# EasyEDA Pro project srm_不晦启明_B.eprj, board PCB1
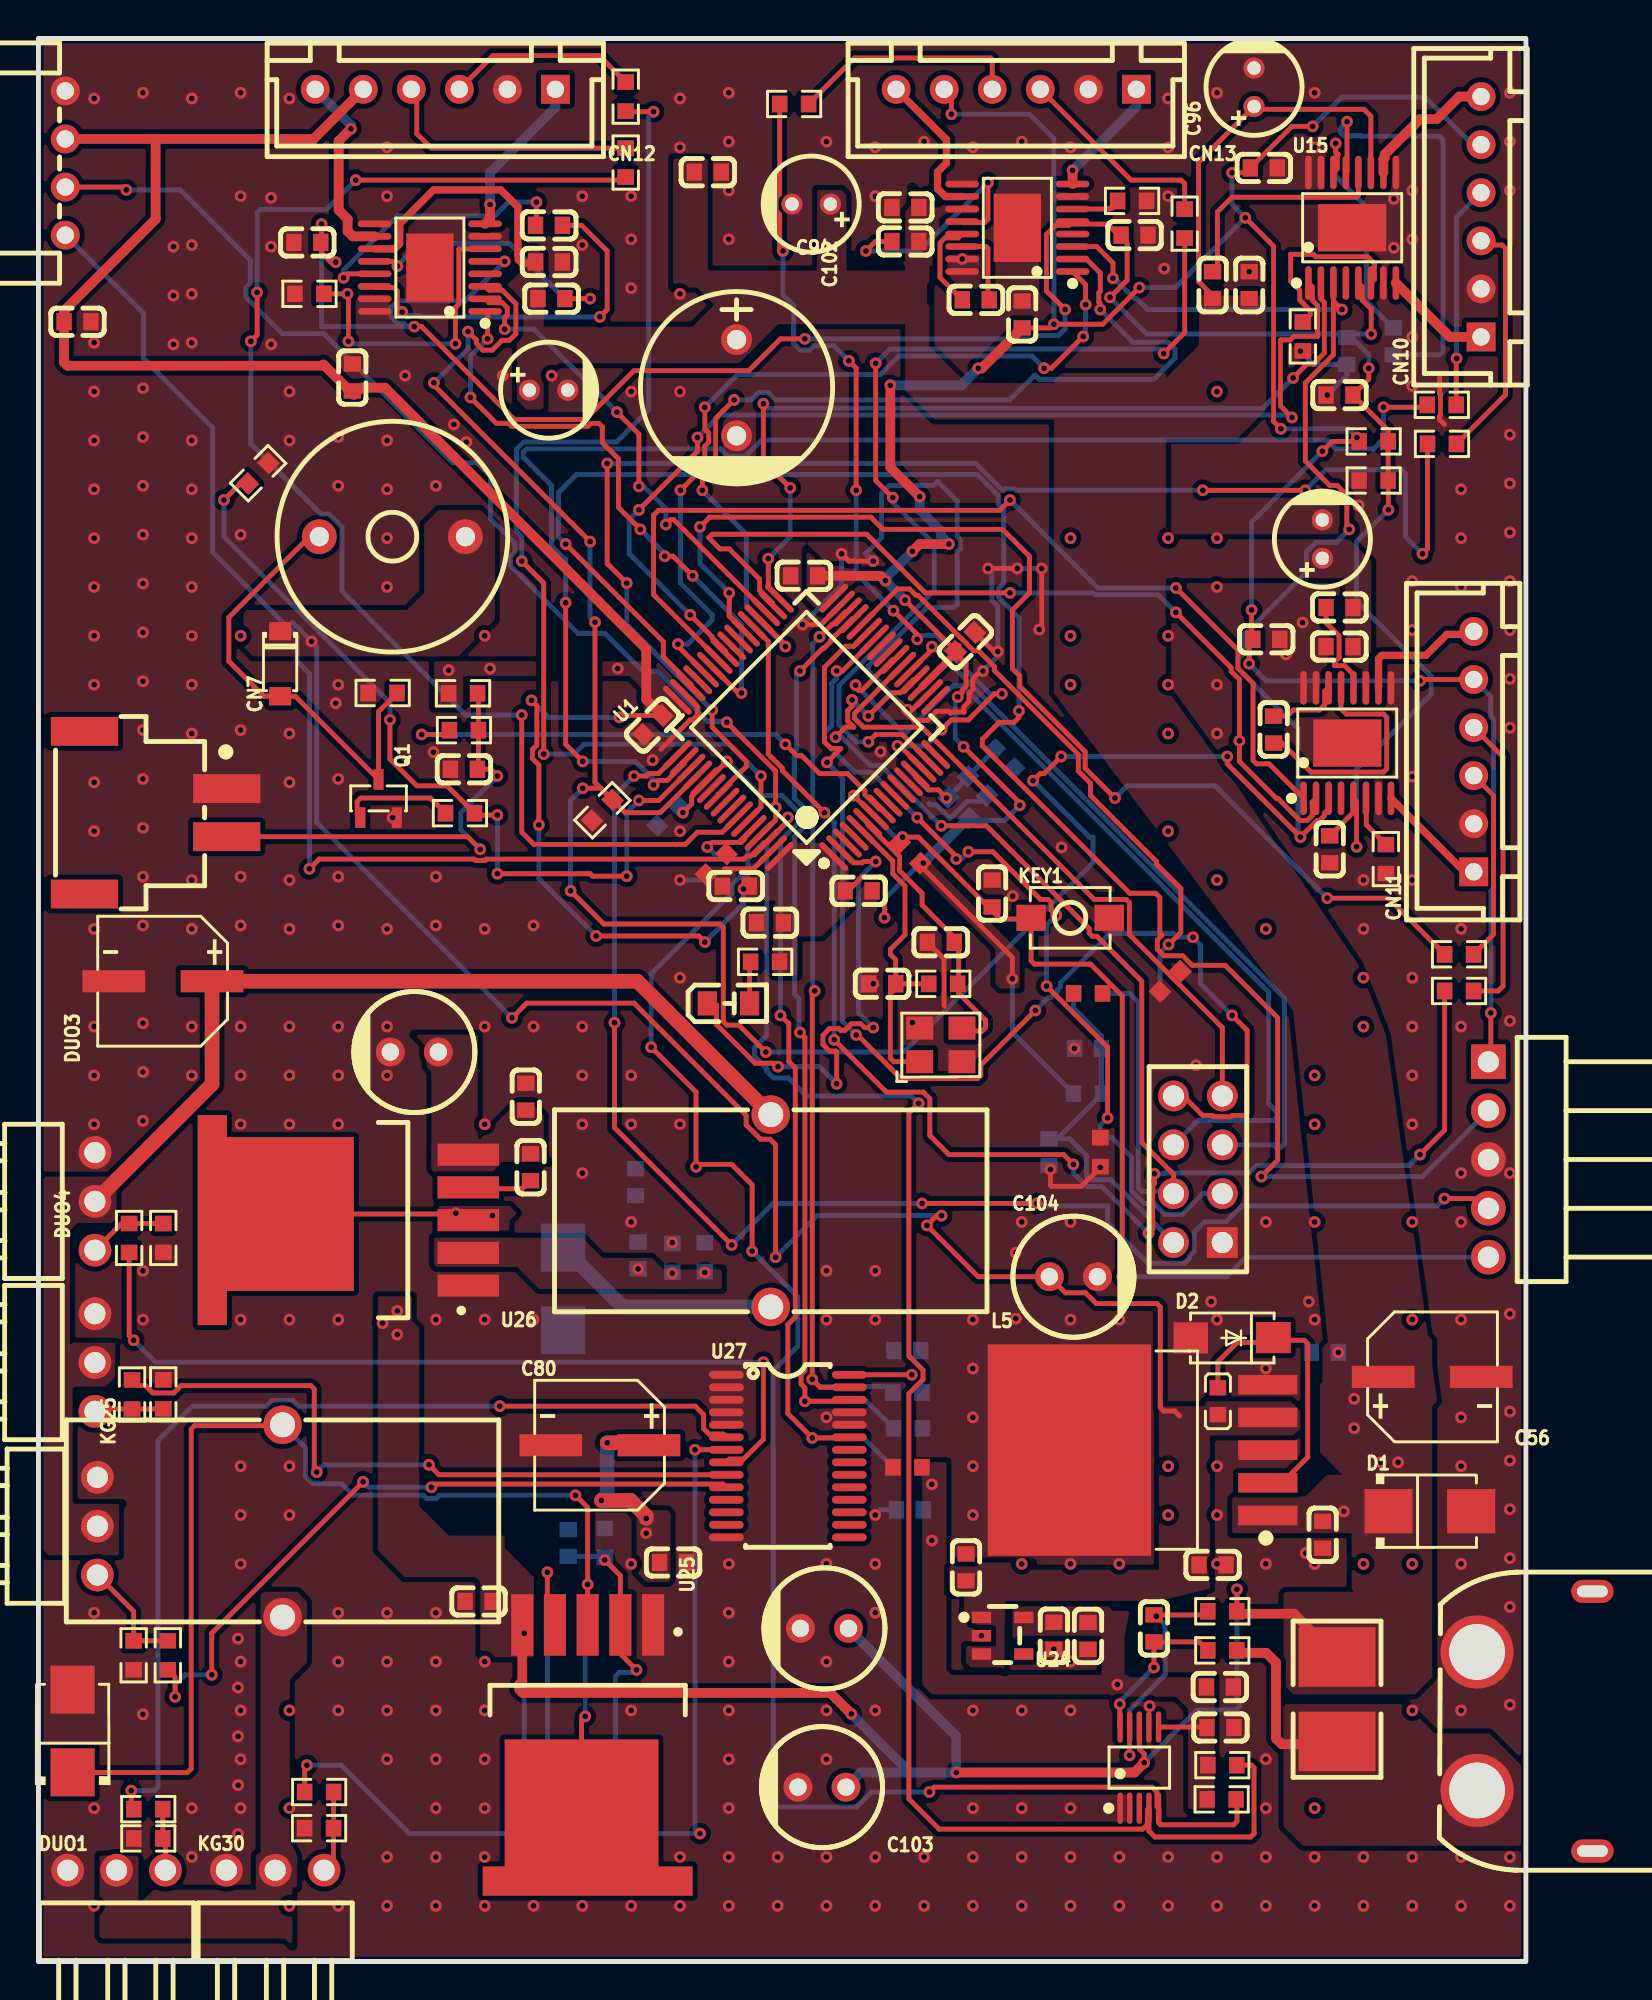
[diagram p13: board, top side]
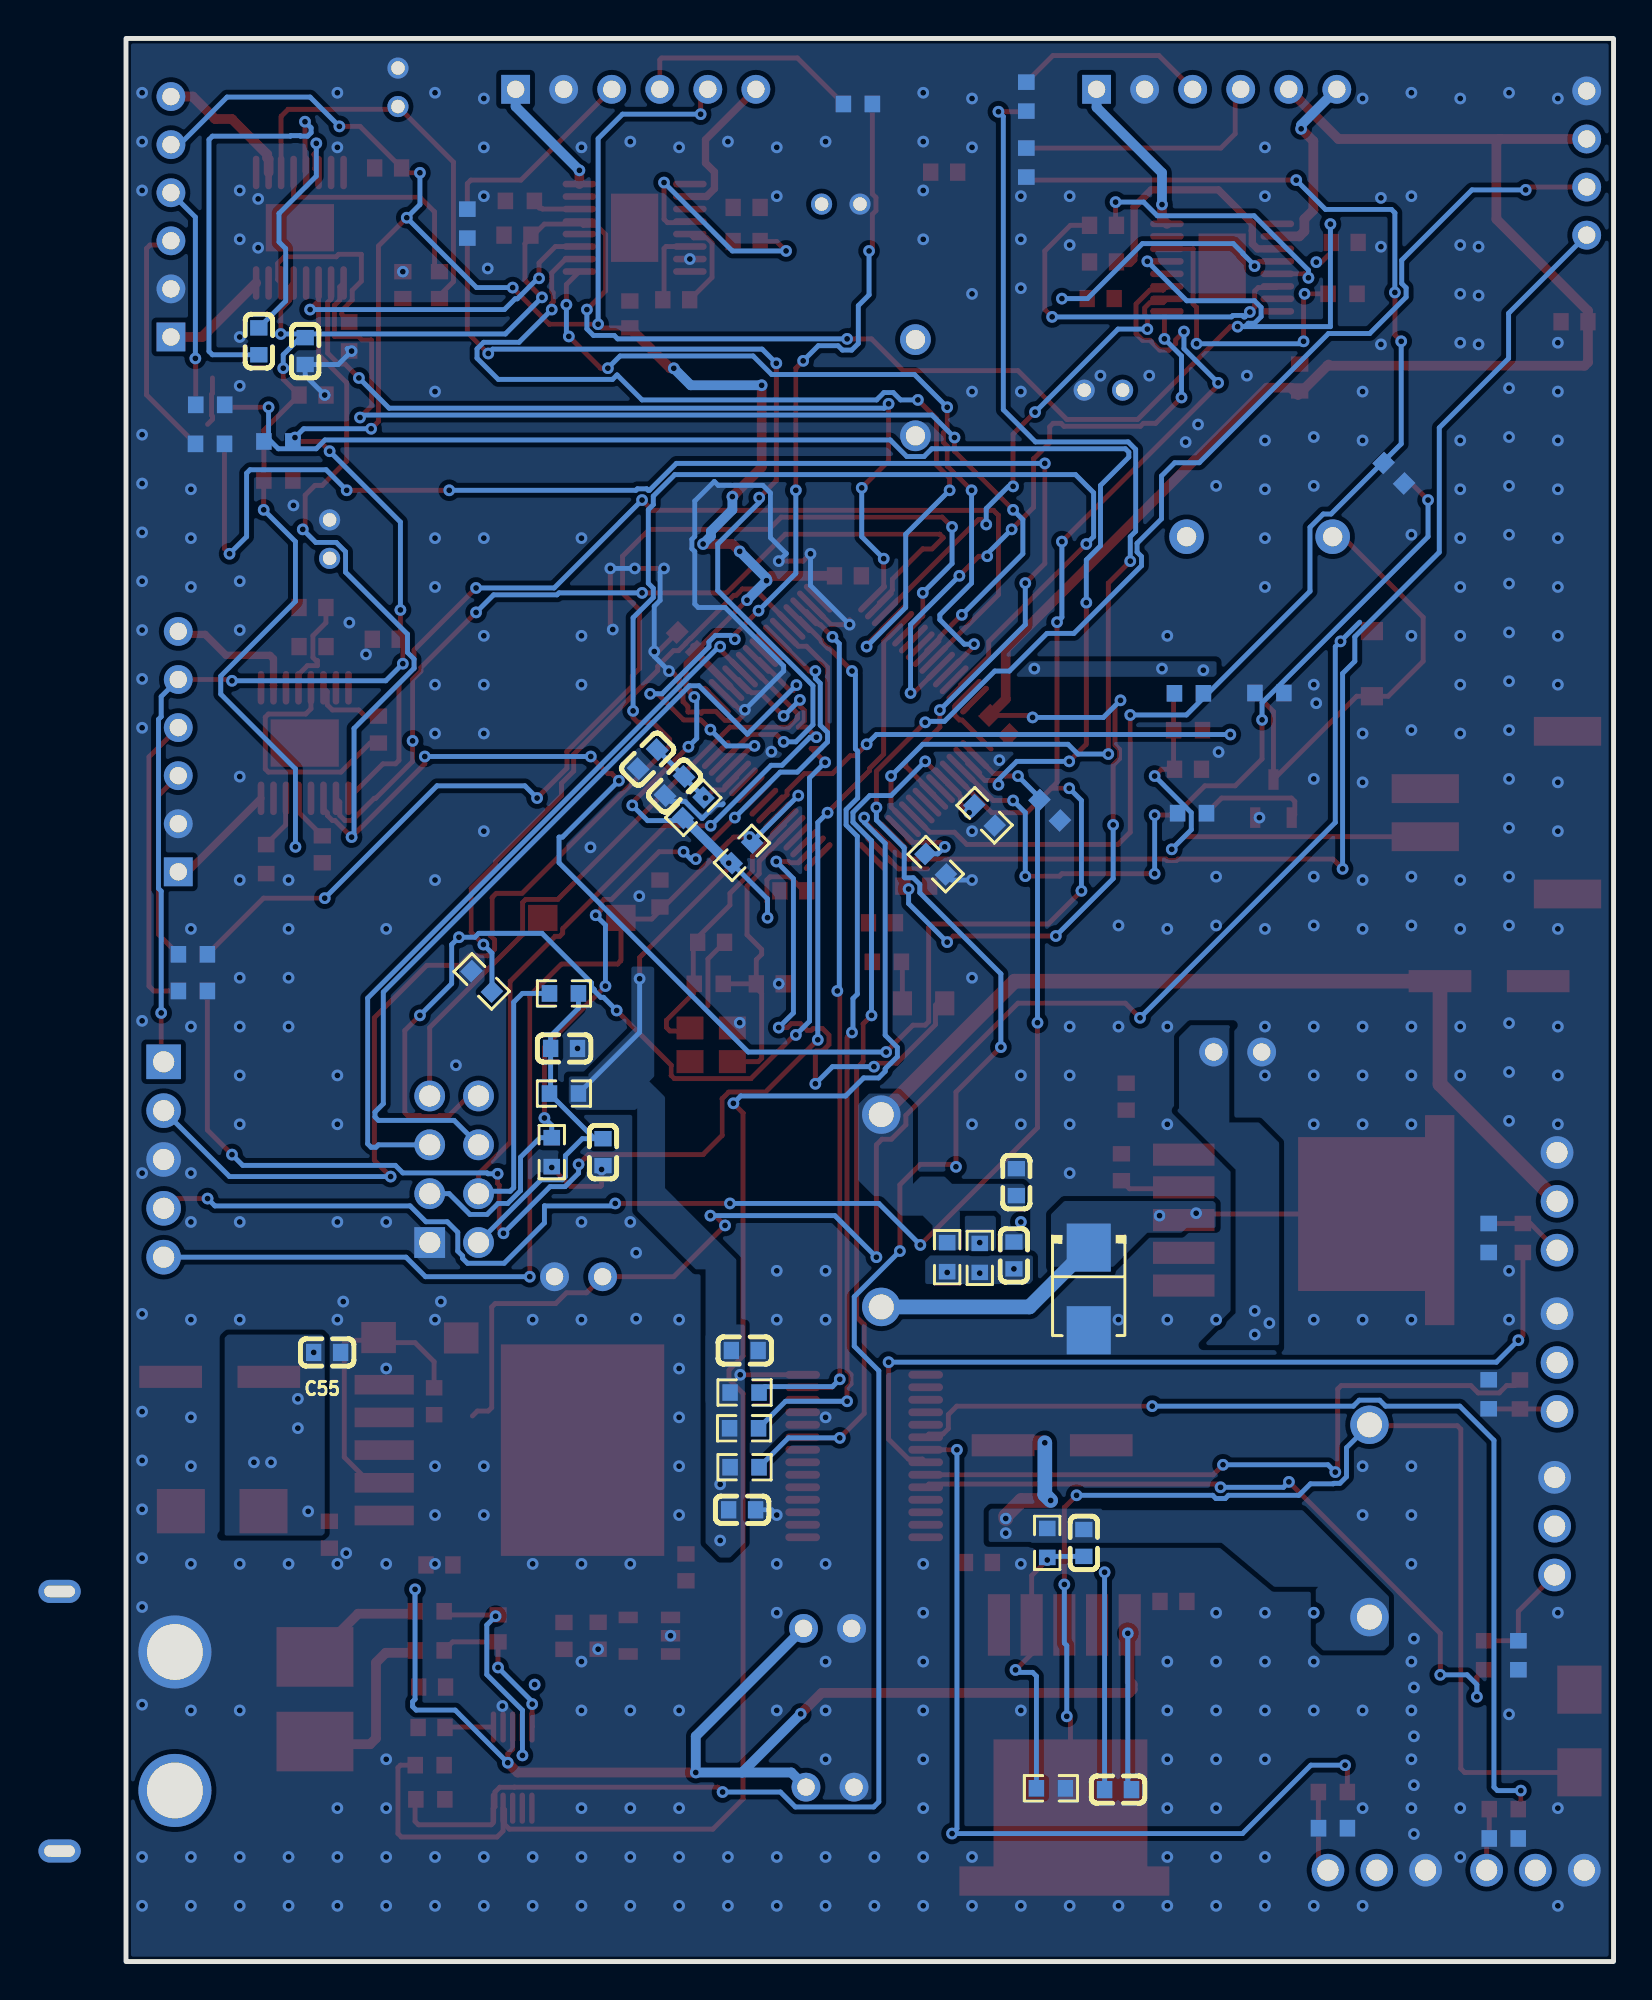
[diagram p14: board, bottom side, seen from below]

Outline 77.39 x 100 mm; copper layers: Top Layer, Bottom Layer. Coordinates in mm from the lower left corner of the outline.
Outline path: rectangle 0,100 77.39,0
Stack: Top Layer 0.035mm / Dielectric1 1.51mm FR4 er 4.5 / Bottom Layer 0.035mm

## Design rules (mm)
template: 自定义配置
spacing copperThickness1oz (default): track to track 0.102, other pairs 0.152 to 0.3
spacing copperThickness2oz: track to track 0.203, other pairs 0.152 to 0.3
track width copperThickness1oz (default): min 0.127, default 0.254, max 2.54
track width copperThickness2oz: min 0.203, default 0.254, max 2.54
differential pair differentialPair (default): width min 0.127, default 0.254, max 2.54; gap min 0.152, default 0.152
via viaSize (default): diameter min 0.5, default 0.61, max 10; hole min 0.3, default 0.305, max 6.3

## Placement (name value [footprint] x y rotation side)
BUZZER1  2.4kHz  [BUZ-TH_BD12.0-P7.60-D0.6-FD]  18.41 74.09 180 top
C10  15pF  [C0603]  46.95 53 0 top
C14  100nF  [C0603]  38.06 54.02 0 top
C15  100nF  [C0603]  48.22 68.62 225 top
C16  100nF  [C0603]  39.83 72.06 0 top
C17  100nF  [C0603]  31.96 64.3 45 top
C18  100nF  [C0603]  36.28 55.92 0 top
C24  15pF  [C0603]  43.9 50.84 0 top
C25  22nF  [C0603]  70.48 84.25 270 bottom
C26  100nF  [C0603]  61.09 87.17 270 top
C27  100nF  [C0603]  62.99 87.17 270 top
C28  100nF  [C0603]  68.07 83.74 90 bottom
C30  22nF  [C0603]  64.26 64.06 270 top
C31  100nF  [C0603]  67.69 70.41 0 top
C32  100nF  [C0603]  67.69 68.38 0 top
C33  100nF  [C0603]  67.18 57.84 90 top
C35  22nF  [C0603]  26.56 90.28 180 top
C36  100nF  [C0603]  26.69 86.47 180 top
C37  100nF  [C0603]  26.56 88.38 180 top
C38  100nF  [C0603]  13.99 89.39 0 top
C40  22nF  [C0603]  48.77 86.41 180 top
C41  100nF  [C0603]  45.11 89.44 0 top
C42  100nF  [C0603]  45.11 91.21 0 top
C43  100nF  [C0603]  57.03 89.77 180 top
C45  100nF  [C0603]  67.69 81.46 0 top
C46  1uF  [C0603]  34.83 93.05 180 top
C48  100nF  [C0603]  63.76 93.27 0 top
C49  100nF  [C0603]  63.88 68.76 0 top
C50  100nF  [C0603]  16.33 82.37 90 top
C51  100nF  [C0603]  51.18 85.65 90 top
C52  100nF  [C0603]  58.04 17.32 270 top
C53  100nF  [C0603]  61.5 12.17 180 top
C54  1uF  [C0603]  61.47 14.28 180 top
C55  1uF  [C0603]  66.93 31.67 0 bottom
C56  1000uF  [CAP-SMD_BD6.3-L6.6-W6.6-RD]  72.52 30.4 180 top
C57  100nF  [C0603]  61.09 20.62 0 top
C60  100nF  [C0603]  66.81 22.19 90 top
C61  1uF  [C0603]  48.26 20.5 270 top
C62  1uF  [C0603]  54.61 16.93 90 top
C63  10uF  [C0603]  52.83 16.94 90 top
C66  1uF  [C0603]  22.9 18.73 180 top
C68  1uF  [C0603]  25.78 8.94 180 bottom
C69  1uF  [C0603]  33.02 20.75 0 top
C72  33nF  [C0603]  27.56 21.77 90 bottom
C73  1uF  [C0603]  25.36 44.97 90 top
C75  1uF  [C0603]  25.6 41.3 90 top
C76  1uF  [C0603]  31.07 40.53 90 bottom
C79  33nF  [C0603]  31.2 36.72 90 bottom
C80  2200uF  [CAP-SMD_BD6.3-L6.6-W6.6-RD]  29.21 26.85 0 top
C81  3300uF  [CAP-SMD_BD6.3-L6.6-W6.6-RD]  6.48 50.98 0 top
C82  1uF  [C0603]  45.34 23.49 180 bottom
C83  100nF  [C0603]  45.2 31.77 180 bottom
C84  100nF  [C0603]  50.25 62.53 315 bottom
C85  1uF  [C0603]  48.85 61.13 315 bottom
C86  4.7uF  [C0603]  42.67 55.68 180 top
C87  10uF  [C0603]  52.58 42.09 90 bottom
C88  100nF  [C0603]  54.6 47.48 0 bottom
C89  100nF  [C0603]  2.03 85.27 0 top
C90  100nF  [C0603]  22.14 62 180 top
C92  100uF  [CAP-TH_BD5.0-P2.00-D0.5-FD]  66.8 73.97 90 top
C94  100uF  [CAP-TH_BD5.0-P2.00-D0.5-FD]  40.21 91.39 180 top
C95  100uF  [CAP-TH_BD5.0-P2.00-D0.5-FD]  26.54 81.71 0 top
C96  100uF  [CAP-TH_BD5.0-P2.00-D0.5-FD]  63.25 97.46 90 top
C97  100nF  [C0603]  49.62 55.54 90 top
C100  220uF  [CAP-TH_BD6.3-P2.50-D0.5-FD]  19.56 47.3 180 top
C101  220uF  [CAP-TH_BD6.3-P2.50-D0.5-FD]  40.89 17.32 180 top
C102  1000uF  [CAP-TH_BD10.0-P5.00-D0.6-FD]  36.32 81.84 270 top
C103  220uF  [CAP-TH_BD6.3-P2.50-D0.5-FD]  40.77 9.07 180 top
C104  220uF  [CAP-TH_BD6.3-P2.50-D0.5-FD]  53.85 35.61 0 top
CN5  XT60PW-M  [CONN-TH_XT60PW-M]  77.85 12.5 180 top
CN6  HX-XH2.54-4PWZ-B  [CONN-TH_HX-XH2.54-4PWZ-B]  1.4 93.52 270 top
CN7  ZX-XH2.54-2PWT  [CONN-SMD_2P-P2.54_MEGASTAR_ZX-XH2.54-2PWT]  6.1 59.74 270 top
CN10  LAIL-PHC2.54-6P-01-XH-L  [CONN-TH_AXH-6A-11]  75.06 90.73 90 top
CN11  LAIL-PHC2.54-6P-01-XH-L  [CONN-TH_AXH-6A-11]  74.68 62.92 90 top
CN12  LAIL-PHC2.54-6P-01-XH-L  [CONN-TH_AXH-6A-11]  20.65 97.36 180 top
CN13  LAIL-PHC2.54-6P-01-XH-L  [CONN-TH_AXH-6A-11]  50.87 97.36 180 top
D1  SMBJ18A  [SMB_L4.3-W3.6-LS5.3-RD]  72.39 23.42 0 top
D2  SS54  [SMA_L4.3-W2.6-LS5.0-FD]  62.1 32.44 0 top
D3  SK1045B  [SMB_L4.3-W3.6-LS5.3-RD]  1.78 11.99 90 top
D4  SK1045B  [SMB_L4.3-W3.6-LS5.3-RD]  27.31 34.98 270 bottom
D10  1N4148W-E3-08  [SOD-123_L2.8-W1.8-LS3.7-RD]  12.57 67.49 270 top
DUO1  HX PZ2.54-1x3P WZ  [HDR-TH_3P-P2.54-H-M-W10.4-N]  4.06 4.75 0 top
DUO3  HX PZ2.54-1x3P WZ  [HDR-TH_3P-P2.54-H-M-W10.4-N]  2.94 39.53 270 top
DUO4  HX PZ2.54-1x3P WZ  [HDR-TH_3P-P2.54-H-M-W10.4-N]  2.94 31.15 270 top
H17  HX PZ2.54-1x5P WZ  [HDR-TH_5P-P2.54-H-M-W10.0-N]  75.44 41.71 270 top
H19  DS1023-2*4SF11  [HDR-TH_8P-P2.54-V-F-R2-C4-S2.54]  60.32 41.2 90 top
KEY1  轻触开关3x4x2  [SW-SMD_L4.0-W2.9-LS5.0]  53.68 54.27 0 top
KG25  HX PZ2.54-1x3P WZ  [HDR-TH_3P-P2.54-H-M-W10.4-N]  3.07 22.64 270 top
KG30  HX PZ2.54-1x3P WZ  [HDR-TH_3P-P2.54-H-M-W10.4-N]  12.32 4.75 0 top
L1  33uH  [L0603]  61.37 29.13 270 top
L4  47uH  [IND-TH_L22.5-W10.5-P10.00-D1.0]  12.7 22.91 0 top
L5  47uH  [IND-TH_L22.5-W10.5-P10.00-D1.0]  38.1 39.04 180 top
LED1  YLED0805R  [LED0805-RD_RED]  35.9 49.83 0 top
Q1  S8050  [SOT-23-3_L2.9-W1.3-P1.90-LS2.3-BR]  17.69 60.47 270 top
R13  1M  [R0603]  47.08 50.84 180 top
R14  10kΩ  [R0603#2]  45.35 57.65 315 bottom
R18  2K  [R0603]  37.81 51.98 0 top
R27  10kΩ  [R0603#2]  69.47 79.05 180 top
R28  30K  [R0603]  69.47 77.01 180 top
R29  2.2K  [R0603]  65.79 84.51 90 top
R31  2.2K  [R0603]  70.1 57.33 90 top
R33  2.2K  [R0603]  14.1 86.72 0 top
R35  2.2K  [R0603]  56.9 91.55 180 top
R37  10kΩ  [R0603#2]  29.34 59.87 225 top
R39  1K  [R0603#2]  73.03 78.92 0 top
R40  1K  [R0603#2]  73.01 80.95 0 top
R41  1K  [R0603#2]  73.91 52.38 0 top
R42  1K  [R0603#2]  73.91 50.47 0 top
R43  1K  [R0603#2]  30.55 96.97 90 top
R44  1K  [R0603#2]  30.55 93.55 90 top
R45  1K  [R0603#2]  59.64 90.37 90 top
R46  1K  [R0603#2]  39.32 96.59 0 top
R47  10  [R0603]  61.59 16.18 0 top
R48  10  [R0603]  61.59 18.21 0 top
R49  4.7K  [R0603]  61.59 10.21 180 top
R50  4.7K  [R0603]  61.56 8.43 0 top
R52  12.4K  [R0603]  29.46 21.77 270 bottom
R53  3.3k  [R0603]  29.27 9.01 180 bottom
R54  12.4K  [R0603]  34.67 36.63 270 bottom
R55  3.3k  [R0603]  32.98 36.59 90 bottom
R56  330  [R0603]  5.71 7.93 0 top
R57  10kΩ  [R0603#2]  5.71 6.4 180 top
R58  330  [R0603]  14.6 8.81 0 top
R59  10kΩ  [R0603#2]  14.6 6.93 180 top
R60  330  [R0603]  4.72 37.62 90 top
R61  10kΩ  [R0603#2]  6.5 37.62 270 top
R64  330  [R0603]  4.87 29.49 270 top
R65  10kΩ  [R0603#2]  6.5 29.5 90 top
R66  330  [R0603]  6.73 15.93 90 top
R67  10kΩ  [R0603#2]  4.95 15.93 270 top
R68  4.7k  [R0603]  45.21 29.59 0 bottom
R69  4.7k  [R0603]  45.24 27.73 180 bottom
R70  10kΩ  [R0603#2]  45.21 25.7 0 bottom
R71  10kΩ  [R0603#2]  35.27 57.06 45 bottom
R72  10kΩ  [R0603#2]  58.89 50.97 45 bottom
R74  10  [R0603]  47.88 60 135 bottom
R75  0  [R0603]  54.61 45.14 0 bottom
R76  10kΩ  [R0603#2]  55.25 42.09 270 bottom
R77  10kΩ  [R0603#2]  54.61 50.34 180 bottom
R78  10kΩ  [R0603#2]  11.43 77.39 225 top
R79  10kΩ  [R0603#2]  22.09 65.95 0 top
R80  1k  [R0603]  22.14 64.03 0 top
R81  10kΩ  [R0603#2]  17.91 65.96 180 top
R85  1K  [R0603#2]  21.93 59.72 0 top
R86  10K  [R0603]  32.73 59.6 225 bottom
R87  2mΩ  [RES-SMD_L6.4-W3.2_SD2512]  67.56 13.64 270 top
U1  -  [LQFP-64_L10.0-W10.0-P0.50-LS12.0-BL]  39.97 64.18 45 top
U15  DRV8874PWPR  [HTSSOP-16_L5.0-W4.4-P0.65-LS6.4-BL-EP]  68.35 90.16 0 top
U19  DRV8874PWPR  [HTSSOP-16_L5.0-W4.4-P0.65-LS6.4-BL-EP]  68.1 63.36 0 top
U20  DRV8874PWPR  [HTSSOP-16_L5.0-W4.4-P0.65-LS6.4-BL-EP]  20.37 88.09 90 top
U21  DRV8874PWPR  [HTSSOP-16_L5.0-W4.4-P0.65-LS6.4-BL-EP]  50.93 90.16 90 top
U22  INA226AIDGSR  [MSOP-10_L3.0-W3.0-P0.50-LS5.0-BL]  57.28 10.08 0 top
U23  LM2596S-5.0(UMW)  [TO-263-5_L10.2-W8.9-P1.70-BR]  58.8 26.59 0 top
U24  AP2112K-3.3TRG1  [SOT-23-5_L2.9-W1.6-P0.95-LS2.8-BR]  50.16 16.94 180 top
U25  XL4015E1  [TO-263-5_L10.2-W8.9-P1.70-TL]  28.57 12.5 270 top
U26  XL4015E1  [TO-263-5_L10.2-W8.9-P1.70-TL]  17.35 38.55 180 top
U27  PCA9685PW,118  [TSSOP-28_L9.7-W4.4-P0.65-LS6.4-TL]  38.99 26.29 0 top
X5  8MHz  [OSC-SMD_4P-L3.2-W2.5-BL]  46.95 47.67 0 top

## Footprints (pads in the part's own frame, mm; a bottom-side part is the same pattern mirrored in y, then rotated)
BUZ-TH_BD12.0-P7.60-D0.6-FD
  round 1.8 hole 1: 1(-3.8,0) 2(3.8,0)
C0603
  rect 0.8x0.9 smd: 1(-0.7,0) 2(0.7,0)
CAP-SMD_BD6.3-L6.6-W6.6-RD
  rect 3.26x1.15 smd: 1(2.555,0) 2(-2.555,0)
CAP-TH_BD5.0-P2.00-D0.5-FD
  round 1.1 hole 0.7: 1(-1,0) 2(1,0)
CAP-TH_BD6.3-P2.50-D0.5-FD
  round 1.5 hole 0.9: 1(-1.25,0) 2(1.25,0)
CAP-TH_BD10.0-P5.00-D0.6-FD
  round 1.6 hole 1: 1(-2.5,0) 2(2.5,0)
CONN-SMD_2P-P2.54_MEGASTAR_ZX-XH2.54-2PWT
  rect 1.5x3.5 smd: 1(-1.25,3.7) 2(1.25,3.7) 3(-4.23,-3.7) 4(4.23,-3.7)
CONN-TH_AXH-6A-11
  rect 1.5x1.5 hole 0.9: 1(-6.25,0)
  round 1.5 hole 0.9: 2(-3.75,0) 3(-1.25,0) 4(1.25,0) 5(3.75,0) 6(6.25,0)
CONN-TH_HX-XH2.54-4PWZ-B
  round 1.5 hole 0.9: 1(-3.75,0) 2(-1.25,0) 3(1.25,0) 4(3.75,0)
CONN-TH_XT60PW-M
  round 3.8 hole 2.9: 1(3,-3.6) 2(3,3.6)
  oval 2.2x1.2 hole 1.6x0.6: 3(-3,6.75) 4(-3,-6.75)
HDR-TH_3P-P2.54-H-M-W10.4-N
  round 1.7 hole 1.1: 1(-2.54,0) 2(0,0) 3(2.54,0)
HDR-TH_5P-P2.54-H-M-W10.0-N
  rect 1.8x1.8 hole 1.1: 1(-5.08,0)
  round 1.8 hole 1.1: 2(-2.54,0) 3(0,0) 4(2.54,0) 5(5.08,0)
HDR-TH_8P-P2.54-V-F-R2-C4-S2.54
  rect 1.6x1.6 hole 1.1: 1(-3.81,-1.27)
  round 1.6 hole 1.1: 2(-3.81,1.27) 3(-1.27,-1.27) 4(-1.27,1.27) 5(1.27,-1.27) 6(1.27,1.27) 7(3.81,-1.27) 8(3.81,1.27)
HTSSOP-16_L5.0-W4.4-P0.65-LS6.4-BL-EP
  oval 0.343x1.746 smd: 1(-2.275,-2.873) 2(-1.625,-2.873) 3(-0.975,-2.873) 4(-0.325,-2.873) 5(0.325,-2.873) 6(0.975,-2.873) 7(1.625,-2.873) 8(2.275,-2.873) 9(2.275,2.873) 10(1.625,2.873) 11(0.975,2.873) 12(0.325,2.873) 13(-0.325,2.873) 14(-0.975,2.873) 15(-1.625,2.873) 16(-2.275,2.873)
  rect 3.55x2.46 smd: 17(0,0)
IND-TH_L22.5-W10.5-P10.00-D1.0
  round 2 hole 1.3: 1(0,-5) 2(0,5)
L0603
  rect 0.8x0.864 smd: 1(-0.7,0) 2(0.7,0)
LED0805-RD_RED
  rect 1x1.25 smd: 1(-1.1,0) 2(1.1,0)
LQFP-64_L10.0-W10.0-P0.50-LS12.0-BL
  oval 0.3x2 smd: 1(-3.75,-5.75) 2(-3.25,-5.75) 3(-2.75,-5.75) 4(-2.25,-5.75) 5(-1.75,-5.75) 6(-1.25,-5.75) 7(-0.75,-5.75) 8(-0.25,-5.75) 9(0.25,-5.75) 10(0.75,-5.75) 11(1.25,-5.75) 12(1.75,-5.75) 13(2.25,-5.75) 14(2.75,-5.75) 15(3.25,-5.75) 16(3.75,-5.75) 33(3.75,5.75) 34(3.25,5.75) 35(2.75,5.75) 36(2.25,5.75) 37(1.75,5.75) 38(1.25,5.75) 39(0.75,5.75) 40(0.25,5.75) 41(-0.25,5.75) 42(-0.75,5.75) 43(-1.25,5.75) 44(-1.75,5.75) 45(-2.25,5.75) 46(-2.75,5.75) 47(-3.25,5.75) 48(-3.75,5.75)
  oval 2x0.3 smd: 17(5.75,-3.75) 18(5.75,-3.25) 19(5.75,-2.75) 20(5.75,-2.25) 21(5.75,-1.75) 22(5.75,-1.25) 23(5.75,-0.75) 24(5.75,-0.25) 25(5.75,0.25) 26(5.75,0.75) 27(5.75,1.25) 28(5.75,1.75) 29(5.75,2.25) 30(5.75,2.75) 31(5.75,3.25) 32(5.75,3.75) 49(-5.75,3.75) 50(-5.75,3.25) 51(-5.75,2.75) 52(-5.75,2.25) 53(-5.75,1.75) 54(-5.75,1.25) 55(-5.75,0.75) 56(-5.75,0.25) 57(-5.75,-0.25) 58(-5.75,-0.75) 59(-5.75,-1.25) 60(-5.75,-1.75) 61(-5.75,-2.25) 62(-5.75,-2.75) 63(-5.75,-3.25) 64(-5.75,-3.75)
MSOP-10_L3.0-W3.0-P0.50-LS5.0-BL
  oval 0.28x1.62 smd: 1(-1,-2.11) 2(-0.5,-2.11) 3(0,-2.11) 4(0.5,-2.11) 5(1,-2.11) 6(1,2.11) 7(0.5,2.11) 8(0,2.11) 9(-0.5,2.11) 10(-1,2.11)
OSC-SMD_4P-L3.2-W2.5-BL
  rect 1.4x1.2 smd: 1(-1.1,-0.875) 2(1.1,-0.875) 3(1.1,0.875) 4(-1.1,0.875)
R0603
  rect 0.806x0.864 smd: 1(-0.753,0) 2(0.753,0)
R0603#2
  rect 0.806x0.864 hole 0.001: 1(-0.753,0) 2(0.753,0)
RES-SMD_L6.4-W3.2_SD2512
  rect 3.1x4 smd: 1(-2.2,0) 2(2.2,0)
SMA_L4.3-W2.6-LS5.0-FD
  rect 1.8x1.62 smd: 1(-2.15,-0.009) 2(2.15,0.009)
SMB_L4.3-W3.6-LS5.3-RD
  rect 2.5x2.3 smd: 1(-2.15,0) 2(2.15,0)
SOD-123_L2.8-W1.8-LS3.7-RD
  rect 0.95x1.15 smd: 1(-1.692,0) 2(1.692,0)
SOT-23-3_L2.9-W1.3-P1.90-LS2.3-BR
  rect 1.07x0.532 smd: 1(0.99,-0.95) 2(0.99,0.95) 3(-0.99,0)
SOT-23-5_L2.9-W1.6-P0.95-LS2.8-BR
  rect 1x0.6 smd: 1(1.1,-0.95) 2(1.1,0) 3(1.1,0.95) 4(-1.1,0.95) 5(-1.1,-0.95)
SW-SMD_L4.0-W2.9-LS5.0
  rect 1.53x1.36 smd: 1(-2.035,0) 2(2.035,0)
TO-263-5_L10.2-W8.9-P1.70-BR
  rect 3.083x1.02 smd: 1(5.16,-3.4) 2(5.16,-1.7) 3(5.16,0) 4(5.16,1.7) 5(5.16,3.4)
  rect 8.5x11 smd: 6(-5.16,0)
TO-263-5_L10.2-W8.9-P1.70-TL
  rect 3.2x1.15 smd: 1(-5.008,3.404) 2(-5.008,1.702) 3(-5.008,0) 4(-5.008,-1.702) 5(-5.008,-3.404)
  custom 8.128x10.922 smd: 6(5.008,-0.318)
TSSOP-28_L9.7-W4.4-P0.65-LS6.4-TL
  oval 1.804x0.406 smd: 1(-3.2,4.225) 2(-3.2,3.575) 3(-3.2,2.925) 4(-3.2,2.275) 5(-3.2,1.625) 6(-3.2,0.975) 7(-3.2,0.325) 8(-3.2,-0.325) 9(-3.2,-0.975) 10(-3.2,-1.625) 11(-3.2,-2.275) 12(-3.2,-2.925) 13(-3.2,-3.575) 14(-3.2,-4.225) 15(3.2,-4.225) 16(3.2,-3.575) 17(3.2,-2.925) 18(3.2,-2.275) 19(3.2,-1.625) 20(3.2,-0.975) 21(3.2,-0.325) 22(3.2,0.325) 23(3.2,0.975) 24(3.2,1.625) 25(3.2,2.275) 26(3.2,2.925) 27(3.2,3.575) 28(3.2,4.225)

## Nets
As in the schematic.

Pads without a net: CN5 3 4; CN7 3 4; U1 3 4 9 10 11 24 25 39 40 45 54 56 57; U15 4; U19 4; U20 4; U21 4; U22 3; U24 4; U27 11 12 13 15 16 17 18 19 20 21 22

## Via types
v1: diameter 0.61, hole 0.305, Top Layer to Bottom Layer, 673 vias

## Routing (per net, layer and track width the routed paths; a pad name or vN(x,y) marks a point on that pad's centre or on a via; arc(x,y) is an arc through that point)
3V3: length 292.1
  Top Layer w0.254: v1(34.67,53.01) 34.35,53.33 v1(29.02,53.33) ; C51.1 52.64,84.95 v1(52.83,85.14) 55.37,85.14 v1(57.28,87.05) ; v1(66.8,78.54) 67.31,79.05 R27.2 ; v1(71.88,66.6) 71.95,66.67 CN11.5 ; v1(25.65,65.58) 25.93,65.3 25.93,63.26 25.7,63.03 25.7,62.55 26.03,62.22 v1(26.03,59.11) ; v1(30.23,64.69) 30.33,64.8 32.46,64.8 ; v1(47.5,96.06) 47.5,96.98 CN13.5 ; v1(47.83,65.76) 48.06,65.99 48.06,66.11 48.26,66.31 48.26,67.51 47.72,68.05 47.72,68.13 ; v1(50.67,51.11) 50.67,52.2 46.1,56.78 46.1,57.07 ; v1(48.13,63.17) 51.05,60.25 v1(51.05,60.12) ; v1(62.79,90.68) 64.26,89.2 64.26,80.09 v1(64.64,79.7) ; v1(75.56,49.33) 75.56,46.91 H17.1 ; v1(63.12,70.28) 63.12,68.82 63.18,68.76 62.99,68.57 v1(62.99,67.49) ; v1(45.09,70.79) 47.72,68.15 ; 58.28,12.19 60.78,12.19 C53.2 ; v1(62.1,93.02) 62.8,93.02 65.22,95.43 v1(66.29,95.43) ; C86.2 42.13,55.68 42.86,56.41 43.89,56.41 44.05,56.24 44.05,55.11 44.02,55.08 v1(44.02,54.28) ; U27.28 v1(45.44,30.51)
  Top Layer w0.381: 47.76,68.09 47.85,68.17 47.85,68.38 ; U1.19 47.72,68.05
  Top Layer w0.508: 5.92,94.77 14.31,94.77 CN12.5 ; 5.92,94.77 6.1,94.59 6.1,90.6 1.33,85.84 C89.1 1.33,83.16 1.51,82.98 14.89,82.98 ; 5.92,94.77 CN6.2 ; C16.2 43.82,72.06 v1(44.07,71.81) ; v1(44.32,81.97) 44.32,77.7 v1(45.85,76.17) ; 16.41,81.46 16.8,81.84 18.03,81.84 31.62,68.25 31.62,65.63 32.46,64.8 ; v1(45.47,73.33) 45.85,73.71 v1(47.37,73.71) ; 16.29,81.58 14.89,82.98 ; 14.89,82.98 14.83,83.05 ; C51.1 49.08,82.85 v1(48.89,82.85)
  Bottom Layer w0.254: v1(34.67,53.01) 36.68,55.02 v1(36.68,55.77) ; CN11.5 75.56,65.78 75.56,64.73 75.7,64.59 75.7,55.8 75.56,55.66 v1(75.56,49.33) ; v1(47.5,96.06) 51.56,96.06 52.83,94.79 v1(52.83,85.14) ; v1(66.8,78.54) 63.12,74.85 v1(63.12,70.28) ; v1(25.65,65.58) 26.54,64.69 v1(30.23,64.69) ; v1(44.02,54.28) 44.02,55.25 R14.2 ; CN10.5 74.61,94.48 72.14,96.95 67.82,96.95 v1(66.29,95.43) ; v1(29.02,53.33) 26.03,56.31 v1(26.03,59.11) ; v1(50.67,51.11) 50.67,48.32 R75.1 ; v1(47.83,65.76) 47.7,65.63 47.7,63.6 v1(48.13,63.17) ; v1(57.28,87.05) 59.15,87.05 v1(62.79,90.68) 62.1,91.36 v1(62.1,93.02) ; 48.25,59.33 50.26,59.33 v1(51.05,60.12) ; v1(62.99,67.49) 63.88,66.6 v1(71.88,66.6) ; v1(64.64,79.7) 68.15,79.7 v1(68.6,79.25)
  Bottom Layer w0.508: v1(44.32,81.97) 48.01,81.97 v1(48.89,82.85) ; v1(45.47,73.33) 44.07,71.93 v1(44.07,71.81) v1(45.09,70.79) ; v1(47.37,73.71) 46.97,74.12 46.97,74.37 45.85,75.48 v1(45.85,76.17) ; R14.2 v1(46.04,57.12) 48.25,59.33
  vias: v1(21.34,67.15) v1(23.5,67.23) v1(30.14,67.23) v1(46.48,24.82) v1(46.48,21.9) v1(56.13,14.4)
5V_LOGIC: length 79.3
  Top Layer w0.254: v1(38.35,36.63) 38.35,42.47 38.06,42.76 37.57,42.76 36.82,43.51 36.82,44 30.99,49.83 25.4,49.83 v1(24.64,49.07) ; 59.37,28.37 59.11,28.63 58.55,28.63 58.37,28.81 58.37,34.03 58.19,34.21 55.04,34.21 54.48,34.77 53.43,34.77 C104.1 48.89,35.61 v1(46.23,38.28) 46.74,38.79 v1(46.99,38.79)
  Bottom Layer w0.254: v1(24.64,49.07) 14.48,59.23 14.48,68.38 v1(14.21,68.65) 13.21,69.65 ; v1(38.35,36.63) 40.51,38.79 v1(46.99,38.79)
GND: length 81.7
  Top Layer w0.254: v1(43.43,72.82) 42.16,72.82 v1(41.78,73.2) ; 35.69,56.82 37.2,56.82 U1.63 ; 73.15,79.93 72.9,80.19 72.9,80.36 72.94,80.4 72.94,81.5 72.9,81.54 72.9,82.35 ; v1(52.65,41.19) 52.65,40.36 52.7,40.31 54.26,40.31 v1(55.25,41.29) ; v1(49.15,67.1) 49.02,67.1 48.62,66.7 48.62,66.16 48.41,65.96 48.41,65.52 48.16,65.26 48.16,64.97 47.52,64.97 47.47,64.92 47.46,64.92 47.37,65.01 46.71,65.01 46.24,64.54 45.54,64.54 45.2,64.89 ; U1.47 34.28,65.27 34.28,64.81 34.03,64.56 33.9,64.56 32.38,63.04 ; 48.72,69.12 49.71,68.12 v1(49.91,68.12) ; 47.12,49.71 47.12,52.14 46.25,53 ; U1.18 46.2,65.82 46.18,65.82 45.45,65.09 v1(45.2,65.09) 45.21,65.08 ; v1(52.2,72.44) 52.2,69.39 v1(52.07,69.27) ; v1(49.4,72.44) v1(50.93,72.44) ; U1.31 40.71,69.52 40,69.52 39.75,69.77
  Bottom Layer w0.254: v1(39.75,69.52) 41.78,71.55 v1(41.78,73.2) ; 34.73,56.53 34.44,56.24 v1(33.38,56.24) ; v1(67.06,81.46) 68.07,82.47 C28.1 66.36,83.04 65.79,83.62 65.79,83.77 65.89,83.87 65.79,83.87 v1(65.66,83.74) ; v1(43.54,23.22) 43.81,23.49 C82.2 ; 45.21,65.08 43.18,67.11 43.18,67.37 46.22,70.41 47.62,70.41 47.8,70.59 47.8,73.32 47.95,73.47 47.95,73.95 47.8,74.1 47.8,75.94 46.79,76.96 46.58,76.76 44.26,76.76 43.87,76.37 43.87,74.04 43.05,73.23 43.05,73.2 v1(43.43,72.82) ; v1(49.15,67.1) 49.91,67.87 v1(49.91,68.12) 49.91,70.48 49.61,70.78 49.61,72.24 v1(49.4,72.44) ; 46.32,60.22 46.38,60.15 46.71,60.15 47.42,59.44 48.32,60.33 49.05,60.33 C85.2 ; v1(50.93,72.44) v1(52.2,72.44)
  vias: v1(2.9,96.88) v1(2.9,84.18) v1(2.9,81.64) v1(2.9,79.1) v1(2.9,76.56) v1(2.9,74.02) v1(2.9,71.48) v1(2.9,68.94) v1(2.9,66.4) v1(2.9,61.32) v1(2.9,58.78) v1(2.9,53.7) v1(2.9,48.62) v1(2.9,46.08) v1(2.9,43.54) v1(2.9,18.14) v1(2.9,7.98) v1(2.9,2.9) v1(5.44,97.18) v1(5.44,81.82) v1(5.44,79.28) v1(5.44,76.74) v1(5.44,74.2) v1(5.44,71.66) v1(5.44,69.12) v1(5.44,66.58) v1(5.44,64.04) v1(5.44,61.5) v1(5.44,58.96) v1(5.44,56.42) v1(5.44,53.88) v1(5.44,48.8) v1(5.44,46.26) v1(5.44,43.72) v1(5.44,35.92) v1(5.44,33.38) v1(5.44,12.85) v1(7.02,89.17) v1(7.02,86.63) v1(7.02,84.09) v1(7.98,96.88) v1(7.98,89.26) v1(7.98,86.72) v1(7.98,84.18) v1(7.98,79.1) v1(7.98,76.56) v1(7.98,74.02) v1(7.98,71.48) v1(7.98,68.94) v1(7.98,66.4) v1(7.98,63.86) v1(7.98,56.24) v1(7.98,53.7) v1(7.98,48.62) v1(7.98,46.08) v1(7.98,7.98) v1(7.98,5.44) v1(10.39,16.79) v1(10.39,14.25) v1(10.39,11.71) v1(10.39,9.17) v1(10.39,6.63) v1(10.52,97.18) v1(10.52,91.8) v1(10.52,74.2) v1(10.52,68.94) v1(10.52,64.04) v1(10.52,56.42) v1(10.52,53.88) v1(10.52,48.62) v1(10.52,46.08) v1(10.52,43.54) v1(10.52,33.38) v1(10.52,25.76) v1(10.52,23.22) v1(10.52,20.68) v1(10.52,15.6) v1(10.52,13.06) v1(10.52,10.52) v1(10.52,7.98) v1(12.1,91.71) v1(12.1,89.17) v1(12.1,84.09) v1(13.06,96.88) v1(13.06,81.64) v1(13.06,79.1) v1(13.06,63.86) v1(13.06,61.32) v1(13.06,56.24) v1(13.06,53.7) v1(13.06,48.62) v1(13.06,46.08) v1(13.06,43.54) v1(13.06,33.38) v1(13.06,25.76) v1(13.06,23.22) v1(13.06,13.06) v1(13.06,7.98) v1(13.06,2.9) v1(15.47,65.43) v1(15.6,79.28) v1(15.6,76.74) v1(15.6,66.4) v1(15.6,61.5) v1(15.6,56.42) v1(15.6,53.88) v1(15.6,48.62) v1(15.6,46.08) v1(15.6,43.54) v1(15.6,33.38) v1(15.6,18.14) v1(15.6,15.6) v1(15.6,13.06) v1(15.6,2.9) v1(18.14,94.34) v1(18.14,91.8) v1(18.14,79.1) v1(18.14,76.56) v1(18.14,74.02) v1(18.14,71.48) v1(18.14,53.7) v1(18.14,48.62) v1(18.14,46.08) v1(18.14,18.14) v1(18.14,15.6) v1(18.14,13.06) v1(18.14,10.52) v1(18.14,5.44) v1(18.14,2.9) v1(18.43,59.48) v1(19.08,82.47) v1(20.55,62.89) v1(20.68,76.74) v1(20.68,56.42) v1(20.68,53.88) v1(20.68,33.38) v1(20.68,18.14) v1(20.68,15.6) v1(20.68,13.06) v1(20.68,10.52) v1(20.68,7.98) v1(20.68,5.44) v1(20.68,2.9) v1(21.62,79.93) v1(22.26,79.01) v1(23.22,68.94) v1(23.22,53.7) v1(23.22,48.62) v1(23.22,43.54) v1(23.22,33.38) v1(23.22,15.6) v1(23.22,13.06) v1(23.22,10.52) v1(23.22,7.98) v1(23.22,5.44) v1(23.22,2.9) v1(24.16,82.47) v1(25.76,53.88) v1(25.76,48.62) v1(25.76,33.38) v1(25.76,2.9) v1(26.7,82.47) v1(28.3,91.8) v1(28.3,89.26) v1(28.3,48.62) v1(28.3,46.08) v1(28.3,43.54) v1(28.3,41) v1(28.3,2.9) v1(30.84,91.8) v1(30.84,89.56) v1(30.84,87.02) v1(30.84,81.64) v1(30.84,46.08) v1(30.84,43.54) v1(30.84,38.46) v1(30.84,20.68) v1(30.84,13.06) v1(30.84,2.9) v1(31.96,62.47) v1(32.98,37.39) v1(33.38,96.88) v1(33.38,94.34) v1(33.38,86.72) v1(33.38,81.64) v1(33.38,58.78) v1(33.38,51.16) v1(33.38,43.54) v1(33.38,5.44) v1(33.38,2.9) v1(35.92,97.18) v1(35.92,94.64) v1(35.92,92.1) v1(35.92,89.56) v1(35.92,20.68) v1(35.92,18.14) v1(35.92,15.6) v1(35.92,13.06) v1(35.92,10.52) v1(35.92,7.98) v1(35.92,5.44) v1(35.92,2.9) v1(38.46,5.44) v1(38.46,2.9) v1(41,94.64) v1(41,35.92) v1(41,33.38) v1(41,28.3) v1(41,20.68) v1(41,15.6) v1(41,13.06) v1(41,10.52) v1(41,5.44) v1(41,2.9) v1(43.43,50.84) v1(43.54,94.34) v1(43.54,91.8) v1(43.54,35.92) v1(43.54,33.38) v1(43.54,20.68) v1(43.54,18.14) v1(43.54,13.06) v1(43.54,5.44) v1(43.54,2.9) v1(43.81,62.92) v1(45.47,48.82) v1(46.08,94.64) v1(46.08,5.44) v1(46.08,2.9) v1(48.06,88.53) v1(48.62,94.34) v1(48.62,33.38) v1(48.62,30.84) v1(48.62,28.3) v1(48.62,25.76) v1(48.62,23.22) v1(48.62,13.06) v1(48.62,7.98) v1(48.62,5.44) v1(48.62,2.9) v1(49.06,16.94) v1(50.69,55.4) v1(50.85,36.86) v1(50.85,33.43) v1(51.16,94.64) v1(51.16,38.46) v1(51.16,20.68) v1(51.16,13.06) v1(51.16,7.98) v1(51.16,5.44) v1(51.16,2.9) v1(52.83,16.24) v1(53.23,57.94) v1(53.7,94.34) v1(53.7,74.02) v1(53.7,68.94) v1(53.7,66.4) v1(53.7,38.46) v1(53.7,33.38) v1(53.7,20.68) v1(53.7,15.6) v1(53.7,13.06) v1(53.7,7.98) v1(53.7,5.44) v1(53.7,2.9) v1(53.9,47.48) v1(56.24,33.38) v1(56.24,20.68) v1(56.24,5.44) v1(56.24,2.9) v1(57.81,13.29) v1(58.57,88.04) v1(58.78,96.88) v1(58.78,94.34) v1(58.78,91.8) v1(58.78,74.02) v1(58.78,68.94) v1(58.78,66.4) v1(58.78,63.86) v1(58.78,58.78) v1(58.78,25.76) v1(58.78,23.22) v1(58.78,5.44) v1(58.78,2.9) v1(60.23,46.61) v1(61.01,34.32) v1(61.32,97.18) v1(61.32,81.64) v1(61.32,74.02) v1(61.32,71.48) v1(61.32,66.4) v1(61.32,63.86) v1(61.32,56.24) v1(61.32,33.38) v1(61.32,25.76) v1(61.32,23.22) v1(61.32,20.68) v1(61.32,5.44) v1(61.32,2.9) v1(62.99,87.87) v1(63.86,53.7) v1(63.86,38.46) v1(63.86,30.84) v1(63.86,20.68) v1(63.86,10.52) v1(63.86,7.98) v1(63.86,5.44) v1(63.86,2.9) v1(64.91,67.97) v1(65.78,69.62) v1(65.94,21.24) v1(66.09,34.32) v1(66.4,97.18) v1(66.4,94.34) v1(66.4,46.08) v1(66.4,43.54) v1(66.4,38.46) v1(66.4,33.38) v1(66.4,20.68) v1(66.4,7.98) v1(66.4,5.44) v1(66.4,2.9) v1(68.68,75.72) v1(68.94,56.24) v1(68.94,53.7) v1(68.94,51.16) v1(68.94,48.62) v1(68.94,20.68) v1(68.94,5.44) v1(68.94,2.9) v1(70.52,91.66) v1(70.52,89.12) v1(71.48,92.1) v1(71.48,89.56) v1(71.48,84.48) v1(71.48,81.94) v1(71.48,71.78) v1(71.48,69.24) v1(71.48,61.62) v1(71.48,56.24) v1(71.48,51.16) v1(71.48,48.62) v1(71.48,46.08) v1(71.48,43.54) v1(71.48,38.46) v1(71.48,33.38) v1(71.48,20.68) v1(71.48,13.06) v1(71.48,5.44) v1(71.48,2.9) v1(74.02,76.56) v1(74.02,74.02) v1(74.02,71.48) v1(74.02,53.7) v1(74.02,48.62) v1(74.02,41) v1(74.02,38.46) v1(74.02,33.38) v1(74.02,28.3) v1(74.02,25.76) v1(74.02,20.68) v1(74.02,13.06) v1(74.02,5.44) v1(74.02,2.9) v1(76.56,97.18) v1(76.56,94.64) v1(76.56,92.1) v1(76.56,79.4) v1(76.56,76.86) v1(76.56,74.32) v1(76.56,71.78) v1(76.56,69.24) v1(76.56,66.7) v1(76.56,64.16) v1(76.56,48.92) v1(76.56,41) v1(76.56,33.68) v1(76.56,28.6) v1(76.56,26.06) v1(76.56,23.52) v1(76.56,20.98) v1(76.56,18.44) v1(76.56,13.36) v1(76.56,5.44) v1(76.56,2.9)
BAT_IN+: length 9.6
  Top Layer w0.508: R47.2 62.48,16.05 63.88,16.05 64.39,15.54 64.39,11.61 64.7,11.3 67.43,11.3 R87.2
BOOT0: length 3.3
  Top Layer w0.254: 36.77,58.41 36.56,58.2 35.03,58.2 v1(34.8,57.96)
  Bottom Layer w0.254: 35.8,57.6 35.16,57.6 v1(34.8,57.96)
BOOT1: length 30.8
  Top Layer w0.254: v1(58.8,52.88) 59.44,53.52 59.44,55.8 58.17,57.07 58.17,57.2 54.74,60.63 54.74,61.27 54.1,61.9 54.1,62.77 49.73,67.14 49.73,67.35 48.91,68.16 48.65,68.16 48.27,68.54 48.27,68.55 48.03,68.8 48.01,68.8 45.77,71.04 45.66,71.04 45.33,71.37 44.69,71.37 42.79,69.48
  Bottom Layer w0.254: v1(58.8,52.88) 58.36,52.44 58.36,50.44
BUZZER: length 42.9
  Top Layer w0.254: v1(9.65,76) 10.52,76.86 R78.2 ; v1(30.61,56.44) 28.83,56.44 28.7,56.57 v1(23.88,56.57) ; v1(23.88,59.61) 22.79,59.61 R85.2 21.26,61.14 19.69,61.14 18.29,62.53 v1(18.29,64.57) ; 33.95,62.06 32.28,60.38 v1(31.24,60.38)
  Bottom Layer w0.254: v1(9.65,76) 9.65,74.09 18.29,65.46 v1(18.29,64.57) ; v1(23.88,56.57) v1(23.88,59.61) ; v1(30.61,56.44) 30.61,59.74 v1(31.24,60.38)
DIR1: length 45.6
  Top Layer w0.254: v1(65.28,82.35) 66,83.07 66.33,83.07 66.9,83.64 66.9,86.27 66.72,86.45 U15.2 ; v1(39.12,76.63) 37.72,78.03 v1(37.72,81) ; v1(37.97,72.95) 37.97,71.47 38.55,70.89
  Bottom Layer w0.254: v1(37.72,81) 37.95,80.77 63.7,80.77 v1(65.28,82.35) ; v1(39.12,76.63) 39.12,74.09 v1(37.97,72.95)
DIR2: length 46.2
  Top Layer w0.254: v1(50.55,71.17) 46.14,71.17 43.1,74.22 35.05,74.22 34.87,74.04 35.45,73.46 35.94,73.46 37.52,71.88 37.52,71.32 38.2,70.64 U1.34 ; v1(62.48,63.47) 62.48,66.67 62.05,67.1 62.05,67.28 v1(59.18,70.16) ; 62.48,63.17 62.48,62.41 64.4,60.49 64.48,60.49 65.63,59.33 66.01,59.33 66.27,59.6 66.27,60.29 U19.2
  Bottom Layer w0.254: v1(50.55,71.17) 54.87,71.17 54.97,71.07 58.27,71.07 v1(59.18,70.16)
DIR3: length 24.3
  Top Layer w0.254: v1(24.26,84.89) 24.26,85.49 24.39,85.62 24.39,86 24.13,86.26 23.44,86.26 23.24,86.46 ; U1.35 33.05,74.98 32.89,74.98 v1(32.64,74.73) ; v1(31.24,76.71) 31.24,79.43 v1(30.1,80.57)
  Bottom Layer w0.254: 31.29,76.71 31.24,76.76 ; v1(30.1,80.57) 25.78,84.89 v1(24.26,84.89) ; v1(32.64,74.73) 32.64,75.55 31.48,76.71
DIR4: length 50.6
  Top Layer w0.254: v1(36.19,81.2) 35.23,80.24 35.23,77.83 34.54,77.14 v1(34.54,76.5) ; v1(55.25,85.9) 55.25,86.22 55.17,86.3 55.17,86.78 55.25,86.86 55.25,87.81 54.52,88.53 53.81,88.53 ; v1(38.86,68.38) 38.86,68.46 U1.36
  Bottom Layer w0.254: v1(38.86,68.38) 36.83,70.41 36.83,74.22 v1(34.54,76.5) ; v1(36.19,81.2) 37.09,81.2 37.48,81.59 37.96,81.59 38.34,81.2 50.55,81.2 51.84,82.5 51.85,82.5 52.08,82.27 58.03,82.27 59.13,83.38 59.13,83.86 58.79,84.2 56.95,84.2 v1(55.25,85.9)
ENC1_A: length 73.7
  Top Layer w0.254: U1.50 33.6,62.31 32.71,61.42 32.23,61.42 v1(32,61.19) ; R40.1 72.13,80.82 v1(69.98,80.82) ; v1(28.32,62.41) 27.43,63.3 v1(27.43,70.66)
  Bottom Layer w0.254: v1(27.43,70.66) 27.43,72.88 26.69,73.62 26.69,76.76 25.22,78.23 25.22,78.48 25.4,78.66 35.47,78.66 35.88,78.26 36.77,78.26 37.63,79.12 67.04,79.12 67.5,78.66 69.47,78.66 69.98,79.17 v1(69.98,80.82) ; v1(32,61.19) 32.08,61.27 32.08,61.38 31.05,62.41 v1(28.32,62.41)
ENC1_B: length 73.9
  Top Layer w0.254: v1(35.05,65.08) 35.05,64.19 36.83,62.41 36.83,62.15 35.37,60.69 U1.55 ; v1(30.61,71.68) 29.59,72.69 v1(29.59,77.9) ; v1(65.91,76.5) v1(60.58,76.5) ; R39.1 72.27,73.47 v1(72.01,73.2)
  Bottom Layer w0.254: v1(72.01,73.2) 71.12,74.09 71.12,77.39 70.94,77.57 66.98,77.57 v1(65.91,76.5) ; v1(35.05,65.08) 30.61,69.52 v1(30.61,71.68) ; v1(29.59,77.9) 29.59,77.9 48.76,77.9 50.16,76.5 50.23,76.5 50.3,76.58 50.79,76.58 50.86,76.5 v1(60.58,76.5)
ENC2_A: length 71.7
  Top Layer w0.254: 37.14,69.48 37.97,68.64 37.97,62.78 38.71,62.05 38.71,61.92 v1(40.89,59.74) ; v1(53.85,41.45) 53.34,41.96 47.37,41.96 46.38,42.95 46.38,44.87 46.04,45.21 44.12,45.21 v1(41.4,47.93) ; v1(57.76,37.87) 57.98,38.09 57.98,40.38 58.06,40.46 v1(58.06,40.96) ; R42.1 73.16,43.24 v1(71.88,41.96)
  Bottom Layer w0.254: v1(71.88,41.96) 71.32,41.4 63.38,41.4 62.99,41.01 58.61,41.01 58.56,40.96 v1(58.06,40.96) ; v1(40.89,59.74) 41.4,59.23 v1(41.4,47.93) ; v1(53.85,41.45) 53.85,41 54.55,40.3 55.33,40.3 v1(57.76,37.87)
ENC2_B: length 60.8
  Top Layer w0.254: v1(34.42,74.6) 34.92,75.11 43.31,75.11 43.94,74.47 50.16,74.47 51.56,73.08 51.56,71.17 50.67,70.28 50.67,67.23 51.05,66.85 51.05,66.32 54.46,62.92 54.46,62.05 v1(56.01,60.5) ; v1(35.94,71.17) 35.94,69.97 36.78,69.13 ; v1(67.06,55.3) 70.24,55.3 R41.1
  Bottom Layer w0.254: v1(56.01,60.5) 56.64,61.14 61.21,61.14 v1(67.06,55.3) ; v1(35.94,71.17) 34.42,72.69 v1(34.42,74.6)
ENC3_A: length 72.2
  Top Layer w0.254: v1(11.05,84.25) 11.38,84.58 v1(11.38,86.79) ; R44.1 30.4,92.63 v1(16.51,92.63) ; U1.58 35.57,58.72 34.29,58.72 33.66,58.09 25.78,58.09 25.15,58.72 v1(25.15,64.82)
  Bottom Layer w0.254: v1(25.15,64.82) 22.22,64.82 15.79,71.25 15.79,74.58 15.1,75.27 14.7,75.27 11.05,78.92 v1(11.05,84.25) ; v1(11.38,86.79) 11.38,90.93 11.56,91.11 14.99,91.11 v1(16.51,92.63)
ENC3_B: length 56.2
  Top Layer w0.254: U1.59 37.59,60.04 v1(37.59,61.65) ; v1(25.15,72.82) 26.29,71.68 v1(26.29,62.79) ; v1(32,96.19) 30.59,96.19 R43.1
  Bottom Layer w0.254: v1(26.29,62.79) 27.88,62.79 28.38,63.3 35.94,63.3 v1(37.59,61.65) ; v1(25.15,72.82) 25.15,74.09 24.86,74.37 24.86,78.63 25.25,79.02 30.07,79.02 31.75,80.7 31.75,95.94 v1(32,96.19)
ENC4_A: length 46.5
  Top Layer w0.254: v1(46.99,64.06) 47.49,64.56 48.38,64.56 49.74,65.92 v1(50.12,65.92) ; v1(42.16,83.24) 42.54,82.86 v1(42.54,76.5) ; R46.1 38.56,91.92 38.38,91.73 38.38,91.04 38.56,90.86 38.56,89.12 v1(38.73,88.95) ; v1(45.72,68.76) 45.72,69.01 v1(44.49,70.25) ; v1(44.7,63.21) 44.82,63.21 U1.14
  Bottom Layer w0.254: v1(42.54,76.5) 42.54,72.19 v1(44.49,70.25) ; v1(46.99,64.06) 46.15,63.21 v1(44.7,63.21) ; v1(42.16,83.24) 41.38,84.02 40.35,84.02 40.12,83.8 39.64,83.8 39.29,84.14 39.29,86.11 38.73,86.66 v1(38.73,88.95) ; v1(50.12,65.92) 49.5,65.92 47.07,68.36 47.07,68.62 46.72,68.96 45.92,68.96 v1(45.72,68.76)
ENC4_B: length 49.7
  Top Layer w0.254: R45.1 59.64,84.71 v1(58.55,83.62) ; v1(43.56,83.11) 43.56,77.01 v1(44.45,76.12) ; v1(43.18,63.42) 43.56,63.8 44.93,63.8 U1.15
  Bottom Layer w0.254: v1(43.56,83.11) 44.3,83.84 58.32,83.84 v1(58.55,83.62) ; v1(43.18,63.42) 42.54,63.42 41.66,64.31 41.66,66.34 46.61,71.3 46.61,73.71 44.45,75.87 v1(44.45,76.12)
ESTOP_ACTIVE: length 23.7
  Top Layer w0.254: R79.2 22.89,65.9 R80.2 22.89,62.05 C90.1 23.52,62 v1(23.88,61.65) ; v1(22.99,57.84) 22.33,58.49 CN7.2
  Bottom Layer w0.254: v1(23.88,61.65) 21.97,59.74 21.97,58.85 v1(22.99,57.84)
I2C1_SCL: length 144.2
  Top Layer w0.254: v1(46.35,8.81) 46.61,9.07 57.18,9.07 57.19,9.06 57.95,9.06 58.2,8.82 58.2,8.06 U22.5 58.29,7.96 58.29,7.21 58.39,7.11 62.18,7.11 62.36,7.29 62.36,8.39 R50.2 ; v1(4.57,92.13) 4.42,92.27 CN6.3 ; 37.49,58.52 37.51,58.52 38.35,59.36 v1(38.35,60.01) 38.35,61.9 v1(35.81,64.44) ; v1(31.88,47.55) 34.21,45.21 v1(34.21,41.33) 34.34,41.45 36.07,41.45 37.13,40.39 v1(37.13,36.94)
  Bottom Layer w0.254: v1(46.35,8.81) 43.34,8.81 42.57,8.04 38.49,8.04 38.23,8.31 38.23,30.72 39.51,32 39.51,34.57 v1(37.13,36.94) ; v1(31.88,47.55) 31.88,51.36 36.09,55.58 36.09,56.01 36.44,56.36 36.87,56.36 36.91,56.39 36.91,57.91 36.96,57.96 36.96,57.96 38.35,59.36 v1(38.35,60.01) ; v1(4.57,92.13) 7.37,92.13 11.02,88.47 11.02,87.26 10.79,87.03 10.79,86.55 12.69,84.66 14.83,84.66 21.55,77.94 22.83,77.94 23.52,77.25 23.52,75.02 24.79,73.75 24.79,73.29 24.56,73.06 24.56,72.58 28.08,69.06 29.48,69.06 31.43,67.11 32.19,67.11 34.81,64.49 35.76,64.49 v1(35.81,64.44)
I2C1_SDA: length 149.4
  Top Layer w0.254: v1(38.99,59.49) 38.99,59.31 U1.62 37.74,58.17 37.07,57.49 36.87,57.49 36.7,57.33 23.31,57.33 23.23,57.25 22.75,57.25 22.67,57.33 14.6,57.33 v1(14.1,56.82) ; v1(45.79,44.63) 45.29,44.12 45.29,31.49 46.02,30.75 46.02,30.27 45.29,29.53 45.29,8.46 46.86,6.88 57.45,6.88 57.7,7.13 57.7,7.89 U22.4 57.78,6.79 58.09,6.48 63.07,6.48 63.25,6.66 63.25,10.08 63.12,10.21 R49.1
  Bottom Layer w0.254: v1(14.1,56.82) 14.1,66.98 13.46,67.61 13.46,68.89 9.07,73.28 9.07,79.76 5.46,83.36 5.46,85.71 CN6.4 ; v1(38.99,59.49) 38.99,59.23 37.9,58.14 37.9,48.17 37.26,47.54 37.26,47.05 37.9,46.42 37.9,46.29 38.24,45.95 39.02,45.95 39.96,45.01 45.41,45.01 v1(45.79,44.63)
I2C2_SCL: length 50.5
  Top Layer w0.254: v1(39.62,48.31) 39.88,48.06 39.88,30.72 39.67,30.52 39.67,30.03 39.88,29.83 v1(39.88,29.13) 42.11,29.13 U27.26 ; v1(39.62,67.11) 40.82,68.3 40.88,68.3 41.22,68.64 41.22,68.71 42.35,69.83 U1.29
  Bottom Layer w0.254: R69.2 43.08,29.13 v1(39.88,29.13) ; v1(39.62,48.31) 39.57,48.36 39.57,50.08 39.34,50.3 39.34,58.51 39.93,59.1 39.93,59.9 39.33,60.5 39.33,62.94 39.45,63.05 39.45,66.93 v1(39.62,67.11)
I2C2_SDA: length 47.4
  Top Layer w0.254: v1(40.64,68.88) 41.27,69.51 41.31,69.51 41.99,70.19 U1.30 ; v1(40.39,50.47) 40.26,50.34 v1(40.26,30.28) 40.67,29.86 U27.27
  Bottom Layer w0.254: R68.1 44.15,29.9 40.64,29.9 v1(40.26,30.28) ; v1(40.64,68.88) 40.28,68.53 40.28,50.57 v1(40.39,50.47)
M1_MOTOR1: length 5.6
  Top Layer w0.508: U15.8 73.43,84.48 CN10.1
M1_MOTOR2: length 7.2
  Top Layer w0.508: CN10.6 73.92,96.98 72.75,95.81 71.88,95.81 70.05,93.97 70.05,93.79 69.97,93.72 U15.10
M2_MOTOR1: length 5.9
  Top Layer w0.381: U19.8 74.19,56.67 CN11.1
M2_MOTOR2: length 7.1
  Top Layer w0.381: CN11.6 74.55,69.17 74.39,69.01 73.28,69.01 72.19,67.92 69.9,67.92 69.72,67.74 69.72,66.36 69.72,66.36 U19.10
M3_MOTOR1: length 8.5
  Top Layer w0.508: 23.24,90.36 23.5,90.62 v1(23.5,91.36)
  Bottom Layer w0.508: v1(23.5,91.36) 23.5,93.02 26.9,96.42 CN12.1
M3_MOTOR2: length 10.1
  Top Layer w0.508: U20.10 16.35,89.71 16.09,89.97 16.09,90.61 15.62,91.07 15.62,94.67 v1(16.26,95.3)
  Bottom Layer w0.508: CN12.6 16.26,95.5 v1(16.26,95.3)
M4_MOTOR1: length 6.3
  Top Layer w0.508: 53.81,92.43 v1(53.81,93.14)
  Bottom Layer w0.508: CN13.1 57.12,96.46 v1(53.81,93.14)
M4_MOTOR2: length 7.9
  Top Layer w0.381: U21.10 47.19,91.78 46.78,92.19 46.78,93.06 47.24,93.52 47.24,94.74 CN13.6
MOTOR_EN: length 161.7
  Top Layer w0.254: U15.3 67.38,86.35 ; 67.38,86.35 67.38,83.55 65.91,82.09 65.91,78.03 67.18,76.76 67.56,76.76 68.07,76.25 68.07,74.6 v1(68.2,74.47) ; 67.38,86.35 v1(67.82,85.9) ; v1(51.75,61.4) 52.12,61.77 52.32,61.77 v1(53.21,62.66) ; 29.26,61.01 28.96,61.31 v1(28.96,69.65) ; 29.26,61.01 v1(28.32,61.01) ; 29.26,61.01 30.53,59.74 32.35,59.74 U1.52 ; v1(27.69,55.68) 29.41,53.95 35.45,53.95 35.63,53.77 35.63,48.87 35.81,48.69 36.45,48.69 v1(37.85,47.3) ; v1(20.57,82.09) 20.57,81.97 v1(28.7,73.84) ; 23.24,87.11 23.44,86.91 24.13,86.91 24.84,86.2 24.84,84.64 24.5,84.3 24.12,84.3 23.61,83.8 23.13,83.8 22.78,84.14 22.78,84.33 v1(22.35,84.76) ; v1(61.85,62.66) 61.85,62.28 v1(65.66,58.47) 66.52,59.33 66.66,59.33 66.92,59.6 66.92,59.73 67.12,59.93 U19.3 ; 53.81,89.18 55.05,89.18 55.91,88.33 v1(55.91,87.53)
  Bottom Layer w0.254: v1(61.85,62.66) v1(53.21,62.66) ; v1(37.85,47.3) 45.02,47.3 54.86,57.14 54.86,58.47 54.69,58.47 v1(51.75,61.4) ; v1(28.7,73.84) 28.7,69.9 v1(28.96,69.65) ; v1(68.2,74.47) 67.52,73.79 66.46,73.79 65.97,73.31 65.97,72.25 62.75,69.02 62.75,68.07 62.41,67.73 62.41,67.25 65.53,64.12 65.53,58.6 v1(65.66,58.47) ; v1(22.35,84.76) 22.35,83.87 v1(20.57,82.09) ; v1(27.69,55.68) 27.69,60.38 v1(28.32,61.01) ; v1(55.91,87.53) 55.97,87.53 57.03,86.46 57.15,86.46 57.71,85.9 v1(67.82,85.9)
NRF_3V3: length 18.5
  Bottom Layer w0.254: 53.02,42.79 C87.2 ; 53.02,42.79 53.66,42.79 54.53,41.91 54.53,40.82 54.7,40.65 55.8,40.65 59.06,37.4 59.06,37.39 ; 53.02,42.79 R75.2 55.3,45.2 C88.2 55.3,48.13 53.86,49.57 R77.2
NRF_CE: length 45.7
  Top Layer w0.254: v1(52.45,50.72) 55.63,47.55 v1(55.63,43.87) ; v1(52.96,54.41) 52.69,54.68 52.69,55.07 52.53,55.23 52.14,55.23 49.66,57.71 v1(48.39,57.71) ; v1(41.53,67.11) 41.84,67.11 U1.26 ; v1(45.72,59.49) 47.75,57.45 v1(47.75,57.33)
  Bottom Layer w0.254: v1(55.63,43.87) 55.25,43.48 R76.1 55.85,42.84 56.87,41.83 56.87,40.09 57.54,39.42 58.04,39.42 58.61,38.85 59.5,38.85 60.58,39.93 H19.3 ; v1(41.53,67.11) 41.53,66.72 41.28,66.47 41.28,64.29 40.89,63.91 40.89,63.42 42.47,61.85 43.36,61.85 v1(45.72,59.49) ; v1(48.39,57.71) 48.01,57.33 v1(47.75,57.33) ; v1(52.96,54.41) 52.45,53.9 v1(52.45,50.72)
NRF_CSN: length 53.9
  Top Layer w0.254: v1(46.97,59.06) 49.32,59.06 54.67,53.71 54.67,53.47 54.84,53.31 55.07,53.31 57.4,50.98 57.4,42.59 59.06,40.94 59.06,39.93 ; v1(41.48,63.67) 42,64.19 42.42,64.19 42.1,64.5 42.1,65.05 42.33,65.28 v1(42.33,65.6) ; U1.20 45.52,66.65 44.84,65.97 44.38,65.97 v1(43.18,64.77)
  Bottom Layer w0.254: v1(42.33,65.6) 43.17,64.77 v1(43.18,64.77) ; R77.1 56.77,50.34 57.22,49.89 57.22,40.24 57.4,40.06 58.93,40.06 59.06,39.93 ; v1(46.97,59.06) 43.83,62.2 43.26,62.2 41.8,63.67 v1(41.48,63.67)
NRF_IRQ: length 60.5
  Top Layer w0.254: v1(41.02,62.36) 41.74,63.08 41.24,63.08 40.89,63.42 40.89,67.3 41.99,68.4 42.42,68.4 43.15,69.13 ; 59.06,45.01 59.56,45.01 60.58,43.99 61.09,43.99 61.15,43.93 62.04,43.93 62.1,43.99 62.74,43.99 62.89,44.14 62.89,48.41 v1(62.1,49.2) ; v1(51.87,49.45) 49.03,46.62 49.03,46.08 48.87,45.91 44.88,45.91 42.61,48.18 v1(42.54,48.18)
  Bottom Layer w0.254: v1(42.54,48.18) 41.83,48.89 41.83,61.55 v1(41.02,62.36) ; v1(62.1,49.2) 60.45,50.85 60.45,52.88 v1(60.07,53.26) 59.25,53.26 59.04,53.47 55.75,53.47 53.17,50.89 53.17,50.69 53.03,50.55 53.03,50.48 52.69,50.14 52.55,50.14 v1(51.87,49.45)
NRF_MISO: length 34.1
  Top Layer w0.254: H19.7 61.59,48.56 56.76,53.4 56.76,55.07 56.6,55.23 54.93,55.23 45.97,64.19 42.93,64.19 42.46,64.65 42.46,64.91 U1.22
NRF_MOSI: length 45.4
  Top Layer w0.254: U1.23 44.46,67.71 42.84,66.09 42.67,66.09
  Bottom Layer w0.254: v1(42.51,66.38) 45.07,63.82 47.59,66.34 48.08,66.34 64.01,50.41 64.01,44.61 64.44,44.17 64.44,43.92 64.26,43.74 60.32,43.74 59.06,42.47
NRF_SCK: length 38.7
  Top Layer w0.254: U1.21 46.48,68.22 v1(46.48,68.38)
  Bottom Layer w0.254: H19.5 64.26,42.47 64.39,42.34 64.64,42.34 64.82,42.52 64.82,50.1 46.54,68.38 v1(46.48,68.38)
NRST: length 55.5
  Top Layer w0.254: U1.7 43.47,59.58 v1(42.42,60.63) ; v1(56.39,35.61) 56.39,50.22 54.74,51.87 51.83,51.87 51.65,52.05 KEY1.1 51.58,54.21 50.05,54.21 45.78,58.47 v1(44.96,58.47)
  Bottom Layer w0.254: 44.82,58.23 v1(42.42,60.63) ; 44.82,58.23 R14.1 ; 44.82,58.23 44.82,58.33 v1(44.96,58.47) ; H17.5 62.83,36.63 61.81,35.61 v1(56.39,35.61)
OSC_IN: length 16.6
  Top Layer w0.254: R13.2 C24.2 44.6,52.1 44.32,52.38 44.32,52.63 45.09,53.39 45.09,55.93 44.45,56.57 44.45,57.22 U1.5 ; X5.1 44.5,46.79 44.32,46.97 44.32,50.34 44.69,50.71
OSC_OUT: length 14.6
  Top Layer w0.254: 43.15,59.23 43.15,59.13 44.81,57.47 44.81,56.71 45.97,55.55 45.97,54.93 47.91,53 47.88,52.97 47.88,50.34 49.28,48.95 49.28,48.56 49.1,48.39 48.21,48.39 X5.3
PC0: length 27.2
  Top Layer w0.254: v1(38.86,63.3) 39.46,62.7 39.71,62.7 40.64,61.77 42.1,61.77 43,60.87 43,60.69 43.75,59.93 U1.8 ; v1(19.94,63.8) 21.16,63.8 R80.1
  Bottom Layer w0.254: v1(19.94,63.8) 38.35,63.8 v1(38.86,63.3)
PWM1: length 55.4
  Top Layer w0.254: U1.41 35.72,68.17 35.05,68.84 35.05,68.89 v1(33.91,70.03) ; v1(65.22,80.29) 64.62,80.89 64.62,84.3 64.64,84.33 65.13,84.33 65.31,84.51 66.55,84.51 66.55,86.12 66.27,86.4 66.27,87.08 U15.1 ; v1(34.29,79.25) 34.29,78.54 v1(31.24,75.49)
  Bottom Layer w0.254: v1(31.24,75.49) 30.73,74.98 30.73,73.2 v1(33.91,70.03) ; v1(34.29,79.25) 35.46,80.42 65.09,80.42 v1(65.22,80.29)
PWM2: length 52.4
  Top Layer w0.254: v1(59.18,71.42) 62.41,68.2 62.41,67.25 63.19,66.46 63.19,62.46 63.37,62.28 64.03,62.28 U19.1 ; v1(50.55,76) 50.01,75.46 32.26,75.46 32,75.21 32,71.08 U1.42
  Bottom Layer w0.254: v1(50.55,76) 55.12,71.42 v1(59.18,71.42)
PWM3: length 31.5
  Top Layer w0.254: v1(36.58,65.96) 36.41,65.96 U1.43 ; v1(22.48,81.33) 23.82,79.99 24.46,79.99 24.62,79.83 28.6,79.83 28.75,79.99 29.16,79.99 29.34,79.81 29.34,78.98 30.17,78.14 30.17,75.62 v1(31.32,74.47) ; v1(32.59,73.08) 33.02,73.08 v1(34.04,72.06) ; v1(23.37,84.38) 23.37,85.65
  Bottom Layer w0.254: v1(32.59,73.08) 32.59,73.2 v1(31.32,74.47) ; v1(36.58,65.96) 36.58,69.52 v1(34.04,72.06) ; v1(23.37,84.38) 22.48,83.49 v1(22.48,81.33)
PWM4: length 42.2
  Top Layer w0.254: 53.81,87.88 54.48,87.2 v1(54.48,86.16) ; v1(54.36,84.51) 52.7,82.86 v1(52.32,82.86) ; v1(33.27,68.5) 33.27,68.39 U1.44 ; v1(34.67,80.82) 34.67,79.69 34.87,79.49 34.87,79.01 34.67,78.8 34.67,77.77 v1(33.4,76.5)
  Bottom Layer w0.254: v1(54.48,86.16) 54.48,84.63 v1(54.36,84.51) ; v1(33.4,76.5) 33.4,71.68 35.05,70.03 35.05,69.77 33.78,68.5 v1(33.27,68.5) ; v1(52.32,82.86) 51.69,83.49 44.77,83.49 43.8,82.52 36.37,82.52 v1(34.67,80.82)
SERVO1_PWM: length 52.2
  Top Layer w0.254: U27.6 35.62,27.43 34.89,27.43 34.61,27.71 34.61,28.44 34.17,28.88 v1(24,28.88) ; v1(4.83,8.89) 4.83,8.06 R56.1
  Bottom Layer w0.254: v1(24,28.88) 13.54,28.88 13.23,29.19 12.17,29.19 11.86,28.88 8,28.88 6.22,27.1 6.22,9.07 6.04,8.89 v1(4.83,8.89)
SERVO2_PWM: length 45.1
  Top Layer w0.254: R58.1 13.85,10.09 v1(13.97,10.21) ; U27.7 v1(34.16,26.61)
  Bottom Layer w0.254: v1(13.97,10.21) 15.75,10.21 19.3,6.66 v1(34.42,6.66) 34.16,6.91 v1(34.16,26.61)
SERVO3_PWM: length 44.3
  Top Layer w0.254: v1(4.95,32.31) 4.72,32.54 R60.1 ; U27.8 35.96,26.13 36.69,26.13 37.72,27.16 v1(37.72,31.17)
  Bottom Layer w0.254: v1(4.95,32.31) 6.1,31.17 v1(37.72,31.17)
SERVO4_PWM: length 36
  Top Layer w0.254: v1(14.48,25.45) 14.35,25.58 14.35,29.77 14.17,29.95 7.42,29.95 7.04,29.57 5.95,29.57 5.57,29.95 5.16,29.95 R64.1 ; v1(20.32,25.83) 20.84,25.31 U27.9
  Bottom Layer w0.254: v1(14.48,25.45) 14.86,25.83 v1(20.32,25.83)
SERVO5_PWM: length 36.8
  Top Layer w0.254: v1(9.02,14.91) 9.02,17.07 v1(16.89,24.94) ; v1(20.45,24.66) 20.62,24.83 35.62,24.83 U27.10 ; v1(7.11,13.77) 7.11,14.79 R66.1
  Bottom Layer w0.254: v1(7.11,13.77) 7.11,14.4 7.62,14.91 v1(9.02,14.91) ; v1(20.45,24.66) 17.17,24.66 v1(16.89,24.94)
SERVO6V_A: length 8.2
  Top Layer w0.762: 31.76,26.85 31.64,26.97 v1(29.59,26.97) ; v1(31.62,23.04) 31.62,23.16 30.81,23.98 v1(29.29,23.98)
  Bottom Layer w0.762: v1(29.59,26.97) 29.59,24.28 v1(29.29,23.98)
  vias: v1(31.62,22.28)
SERVO6V_B: length 45.9
  Top Layer w0.762: DUO3.2 9.03,45.62 C81.1 31.16,50.98 L5.1
SERVO_OE_N: length 49.7
  Top Layer w0.254: U27.23 42.16,27.23 v1(40.26,27.23) 38.99,28.5 38.99,33.12 39.38,33.51 39.38,46.46 39.04,46.8 39.04,48.77 v1(38.61,49.2) ; v1(35.81,62.41) 34.75,61.35 U1.53 34.66,61.25 33.99,60.57 33.99,60.2 v1(33.53,59.74)
  Bottom Layer w0.254: 33.26,60.14 33.53,59.87 v1(33.53,59.74) ; R70.1 42.93,27.23 v1(40.26,27.23) ; v1(35.81,62.41) 37.59,60.63 38.7,60.63 39.57,59.75 39.57,59.25 38.61,58.28 v1(38.61,49.2)
STATUS_LED: length 26.5
  Top Layer w0.254: v1(38.48,46.53) 38.3,46.71 37.29,46.71 35.28,48.72 35.28,49.74 35.19,49.83 LED1.1 ; U1.2 42.41,57.14 42.87,57.14 42.93,57.2 v1(43.56,57.2) ; v1(41.53,45.64) 41.53,47.3 41.48,47.35 41.16,47.35 40.82,47.69 40.82,48.17 41.16,48.51 41.64,48.51 41.73,48.43 41.96,48.43 42.3,48.77 42.79,48.77 42.99,48.56 v1(43.43,48.56)
  Bottom Layer w0.254: v1(43.43,48.56) 42.67,49.33 42.67,56.31 v1(43.56,57.2) ; v1(38.48,46.53) 40.64,46.53 v1(41.53,45.64)
SWCLK: length 74.4
  Top Layer w0.254: v1(30.99,61.65) 31.63,61.65 31.76,61.77 32.26,61.77 U1.49 ; v1(51.94,39.42) v1(45.97,39.42) ; v1(36.07,37.26) 29.97,43.36 v1(29.97,48.82) ; H17.4 74.93,39.67 v1(73.15,39.67)
  Bottom Layer w0.254: v1(29.97,48.82) 29.97,60.63 v1(30.99,61.65) ; v1(45.97,39.42) 38.23,39.42 v1(36.07,37.26) ; v1(73.15,39.67) 72.77,39.29 62.61,39.29 61.79,38.47 60.68,38.47 60.13,37.92 60.13,36.94 59.88,36.69 59.88,36.56 59.63,36.31 57.72,36.31 55.63,38.41 55.63,39.29 55.62,39.29 52.07,39.29 v1(51.94,39.42)
SWDIO: length 96.5
  Top Layer w0.254: v1(27.43,73.71) 32.51,68.63 32.51,67.84 33.95,66.4 33.95,66.3 ; v1(51.01,65.03) 51.01,64.69 50.76,64.44 49.99,64.44 49.11,63.56 49.11,63.22 56.78,55.55 58.12,55.55 58.34,55.33 58.34,53.49 58.44,53.39 58.44,53.35 58.22,53.12 58.22,52.64 58.56,52.3 59.53,52.3 60.03,51.8 61.74,51.8 64.47,49.07 64.47,41.67 v1(63.63,40.82)
  Bottom Layer w0.254: v1(63.63,40.82) 72.01,40.82 H17.2 ; v1(51.01,65.03) 51.01,69.88 49.96,70.93 49.96,71.41 50.22,71.67 50.22,75.5 49.96,75.75 49.96,76.2 48.84,77.32 27.99,77.32 27.05,76.38 27.05,74.09 v1(27.43,73.71)
VM_12V: length 115.3
  Top Layer w0.254: C26.2 61.09,86.63 60.36,87.36 60.36,93.57 C96.1 63.39,96.32 68.96,96.32 69.32,95.95 U15.11 ; R48.2 62.36,18.22 v1(62.36,19.35) ; v1(57.53,10.34) 57.53,10.8 57.28,11.05 57.28,12.19
  Top Layer w0.381: C37.2 25.79,88.3 25.16,88.3 24.97,88.49 24.97,88.7 24.94,88.73 24.94,91.24 24.06,92.13 20.56,92.13 18.8,90.36 18.8,90 18.79,90 18.79,89.33 18.52,89.06 U20.11
  Top Layer w0.508: v1(42.29,12.88) 41.2,13.97 25.2,13.97 25.02,14.15 25.02,14.4 25.17,14.55 U25.5 ; 62.35,18.09 65.32,18.09 67.56,15.84 ; v1(47.75,9.83) 57.02,9.83 v1(57.53,10.34)
  Bottom Layer w0.254: v1(25.27,17.07) 25.27,9.13 25.08,8.94 ; v1(57.53,10.34) 60.27,13.08 62.3,13.08 62.48,13.26 62.48,13.51 62.36,13.64 v1(62.36,19.35)
  Bottom Layer w0.508: 45.34,9.83 v1(47.75,9.83) 47.75,11.72 C101.1 ; 45.34,9.83 v1(42.29,12.88) ; 45.34,9.83 42.78,9.83 C103.1
  vias: v1(17.91,33.2) v1(18.67,33.83) v1(18.67,32.6) v1(67.63,31.67) v1(67.92,23.41) v1(68.45,29.26) v1(68.45,27.74) v1(69.85,25.96) v1(70.74,25.96)
VREF_SET: length 127.9
  Top Layer w0.254: 53.67,90.35 55.63,90.35 56.64,89.33 56.64,87.43 v1(55.75,86.54) ; 53.67,90.35 53.61,90.28 52.92,90.28 52.44,89.81 52.44,86.88 v1(53.42,85.9) ; 53.67,90.35 53.81,90.48 ; v1(39.88,84.38) 38.61,84.38 36.96,82.73 30.99,82.73 28.45,80.19 24.76,80.19 19.94,85.01 v1(19.56,85.01) ; v1(70.23,75.49) 70.23,77 R28.1 R27.1 70.22,79.63 C45.2 69.22,82.28 v1(69.22,82.86) ; C33.2 68.42,59.77 U19.5 68.58,60.33 v1(68.58,57.96) ; v1(14.73,90.35) 14.73,88.84 15.21,88.37 v1(15.46,88.37) ; U15.5 68.87,87.08 68.87,86.4 69.34,85.93 v1(69.34,84.63) ; 23.24,88.41 v1(24.26,88.41)
  Bottom Layer w0.254: 68.14,84.63 57.66,84.63 v1(55.75,86.54) ; 68.14,84.63 v1(69.34,84.63) ; 68.14,84.63 69.22,83.55 v1(69.22,82.86) ; v1(70.23,75.49) 68.58,73.84 68.58,70.73 72.47,66.84 72.47,65.9 68.58,62.02 v1(68.58,57.96) ; v1(39.88,84.38) 51.82,84.38 51.99,84.56 53.07,84.56 53.42,84.9 v1(53.42,85.9) ; 19.18,85.01 19,85.19 18.68,85.19 18.34,85.53 18.34,86.02 18.68,86.36 22.21,86.36 v1(24.26,88.41) ; 19.18,85.01 14.73,85.01 v1(14.73,90.35) ; 19.18,85.01 v1(19.56,85.01)
$1N4387: length 2.2
  Top Layer w0.254: R18.1 37,51.93 LED1.2
$1N5949: length 5.9
  Top Layer w0.254: v1(47.24,60.5) 46.82,60.92 46.3,60.92 45.62,61.6 U1.13
  Bottom Layer w0.254: 47.24,60.46 v1(47.24,60.5) ; 47.24,60.46 47.18,60.39 ; 47.24,60.46 48.36,61.57 C85.1 49.76,63.02
$2N2257: length 12.8
  Top Layer w0.254: v1(67.49,94.54) 67.49,94.1 67.63,93.97 67.57,93.92 67.57,93.23 U15.14
  Bottom Layer w0.254: C25.1 69.09,86.35 69.09,89.07 69.43,89.42 69.43,90.9 67.49,92.84 v1(67.49,94.54)
$2N2292: length 22.5
  Top Layer w0.254: U15.13 68.08,93.09 v1(68.08,95.67)
  Bottom Layer w0.254: v1(68.08,95.67) 67.77,95.35 67.77,95.1 67.94,94.92 68.31,94.92 68.34,94.94 68.82,94.94 68.85,94.92 72.9,94.92 73.08,94.74 73.08,83.73 72.9,83.55 C25.2
$2N2297: length 12.1
  Top Layer w0.254: U15.12 68.67,91.84 68.58,91.75 62.1,91.75 61.34,90.98 61.34,88.13 C26.1
$2N2730: length 9.7
  Top Layer w0.254: R29.2 66.17,85.64 66.17,85.85 65.62,86.4 65.62,86.9 65.15,87.38 65.15,88.78 66.33,88.78 66.46,88.65 69.16,88.65 69.51,88.3 69.51,87.47 U15.6
$2N4081: length 3.9
  Top Layer w0.254: C30.1 64.97,64.76 65.28,65.08 66.66,65.08 66.92,65.35 66.92,66.03 U19.14
$2N4083: length 12.9
  Top Layer w0.254: C30.2 64.69,63.36 66.21,61.85 69.99,61.85 70.15,62.02 70.15,64.71 69.99,64.87 68.05,64.87 67.77,65.15 U19.13
$2N4086: length 5.3
  Top Layer w0.254: U19.12 68.42,66.92 67.96,67.39 67.44,67.39 67.44,67.65 67.51,67.65 67.67,67.81 67.67,68.94 66.99,69.62 C31.1
$2N4103: length 3
  Top Layer w0.254: 70.23,57.96 69.09,59.11 69.09,60.47 U19.6
$2N4591: length 19.4
  Top Layer w0.254: C35.1 28.26,90.28 29.59,88.95 29.59,85.9 v1(29.21,85.52) ; U20.14 17.56,87.05 18.49,87.05 18.67,86.87 18.67,86.03 v1(18.92,85.78)
  Bottom Layer w0.254: v1(29.21,85.52) 19.88,85.52 19.8,85.6 19.32,85.6 19.24,85.52 19.18,85.52 v1(18.92,85.78)
$2N4593: length 14.8
  Top Layer w0.254: U20.13 16.08,87.76 v1(15.88,87.55) ; C35.2 25.91,90.33 v1(25.91,91.49)
  Bottom Layer w0.254: v1(25.91,91.49) 24.45,91.49 23.74,90.78 18.7,90.78 15.88,87.95 v1(15.88,87.55)
$2N4596: length 14.3
  Top Layer w0.254: v1(18.68,88.16) 18.43,88.41 17.49,88.41 ; C36.1 v1(28.7,86.47)
  Bottom Layer w0.254: v1(28.7,86.47) 27.37,86.47 24.51,89.33 19.79,89.33 19.28,88.83 19.28,88.8 18.68,88.2 v1(18.68,88.16)
$2N4613: length 15.7
  Top Layer w0.254: v1(21.7,84.12) 21.7,86.01 21.88,86.19 21.88,89.06 23.24,89.06 ; 14.85,86.72 v1(16.08,86.72) 16.13,86.67 v1(16.13,84.25)
  Bottom Layer w0.254: v1(16.13,84.25) 16.26,84.12 v1(21.7,84.12)
$2N5101: length 4.1
  Top Layer w0.254: U21.14 49.3,89.18 49.4,89.08 49.4,86.48 C40.1
$2N5103: length 4.8
  Top Layer w0.254: C40.2 46.91,87.57 46.91,89.37 47.17,89.63 47.86,89.63 U21.13
$2N5106: length 12.7
  Top Layer w0.254: v1(43.05,88.95) 43.54,89.44 C41.1 ; v1(49.4,92.51) 49.4,90.6 49.22,90.42 48.12,90.42 U21.12
  Bottom Layer w0.254: v1(49.4,92.51) 45.85,88.95 v1(43.05,88.95)
$2N5123: length 2.1
  Top Layer w0.254: 55.89,91.17 55.77,91.17 55.73,91.13 53.81,91.13
$2N6699: length 10.1
  Top Layer w0.254: CN11.3 75.7,60.64 75.7,53.41 R41.2
$2N6732: length 15.7
  Top Layer w0.254: R42.2 75.95,50.47 76.2,50.72 76.2,62.64 CN11.4
$2N6800: length 10
  Top Layer w0.254: R43.2 29.17,99.11 23.65,99.11 CN12.3
$2N6836: length 13.6
  Top Layer w0.254: CN12.4 19.69,97.07 19.69,95.05 20.43,94.3 R44.2
$2N18106: length 10.9
  Top Layer w0.254: R45.2 59.64,92.45 59.46,92.63 56.85,92.63 CN13.3
$2N18108: length 12.1
  Top Layer w0.254: CN13.4 49.62,98.89 49.53,98.98 42.46,98.98 R46.2
$2N18110: length 12.7
  Top Layer w0.254: R39.2 76.33,81.47 76.33,89.08 76.15,89.26 75.28,89.26 CN10.3
$2N18112: length 11.6
  Top Layer w0.254: v1(73.79,83.36) 73.77,83.34 R40.2
  Bottom Layer w0.254: CN10.4 73.79,90.71 v1(73.79,83.36)
$3N366: length 8.2
  Top Layer w0.254: v1(56.26,13.39) 56.26,12.21 56.28,12.19 ; R47.1 60.4,16.62 C52.2 v1(58.04,15.29)
  Bottom Layer w0.254: v1(58.04,15.29) 56.26,13.51 v1(56.26,13.39)
$3N371: length 12.6
  Top Layer w0.254: 56.78,12.19 56.77,12.19 v1(56.77,10.72) ; R48.1 60.65,18.02 C52.1
  Bottom Layer w0.254: v1(58.17,17.96) 58.62,17.5 58.62,14.92 56.77,13.07 v1(56.77,10.72)
